# Altium schematic sheet UC3842原理图.SchDoc (part 1 of 2)
size 1651 x 1651 mm; SheetNumber: 12; SheetTotal: 16
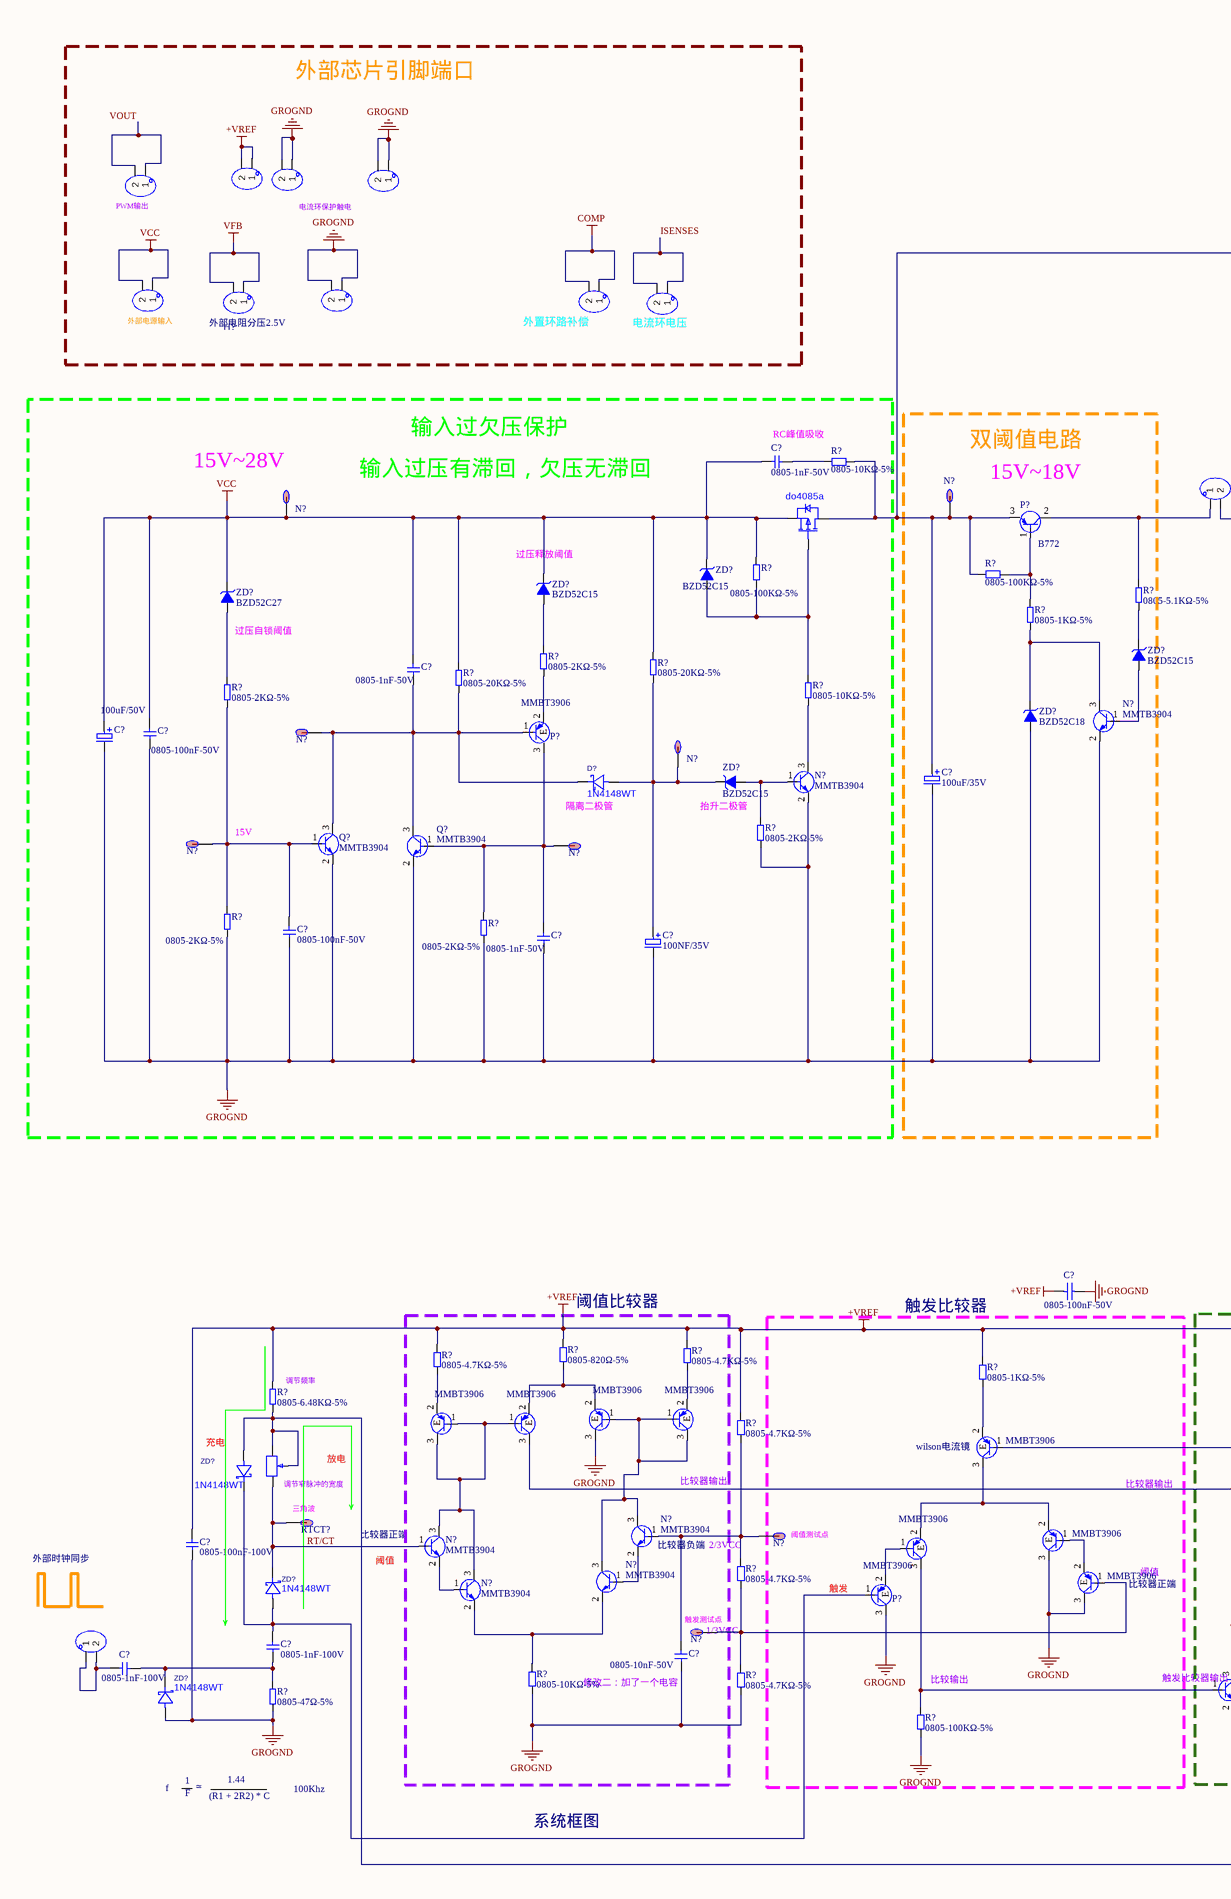
[diagram p0: UC3842原理图.SchDoc, top column 1 of 4]
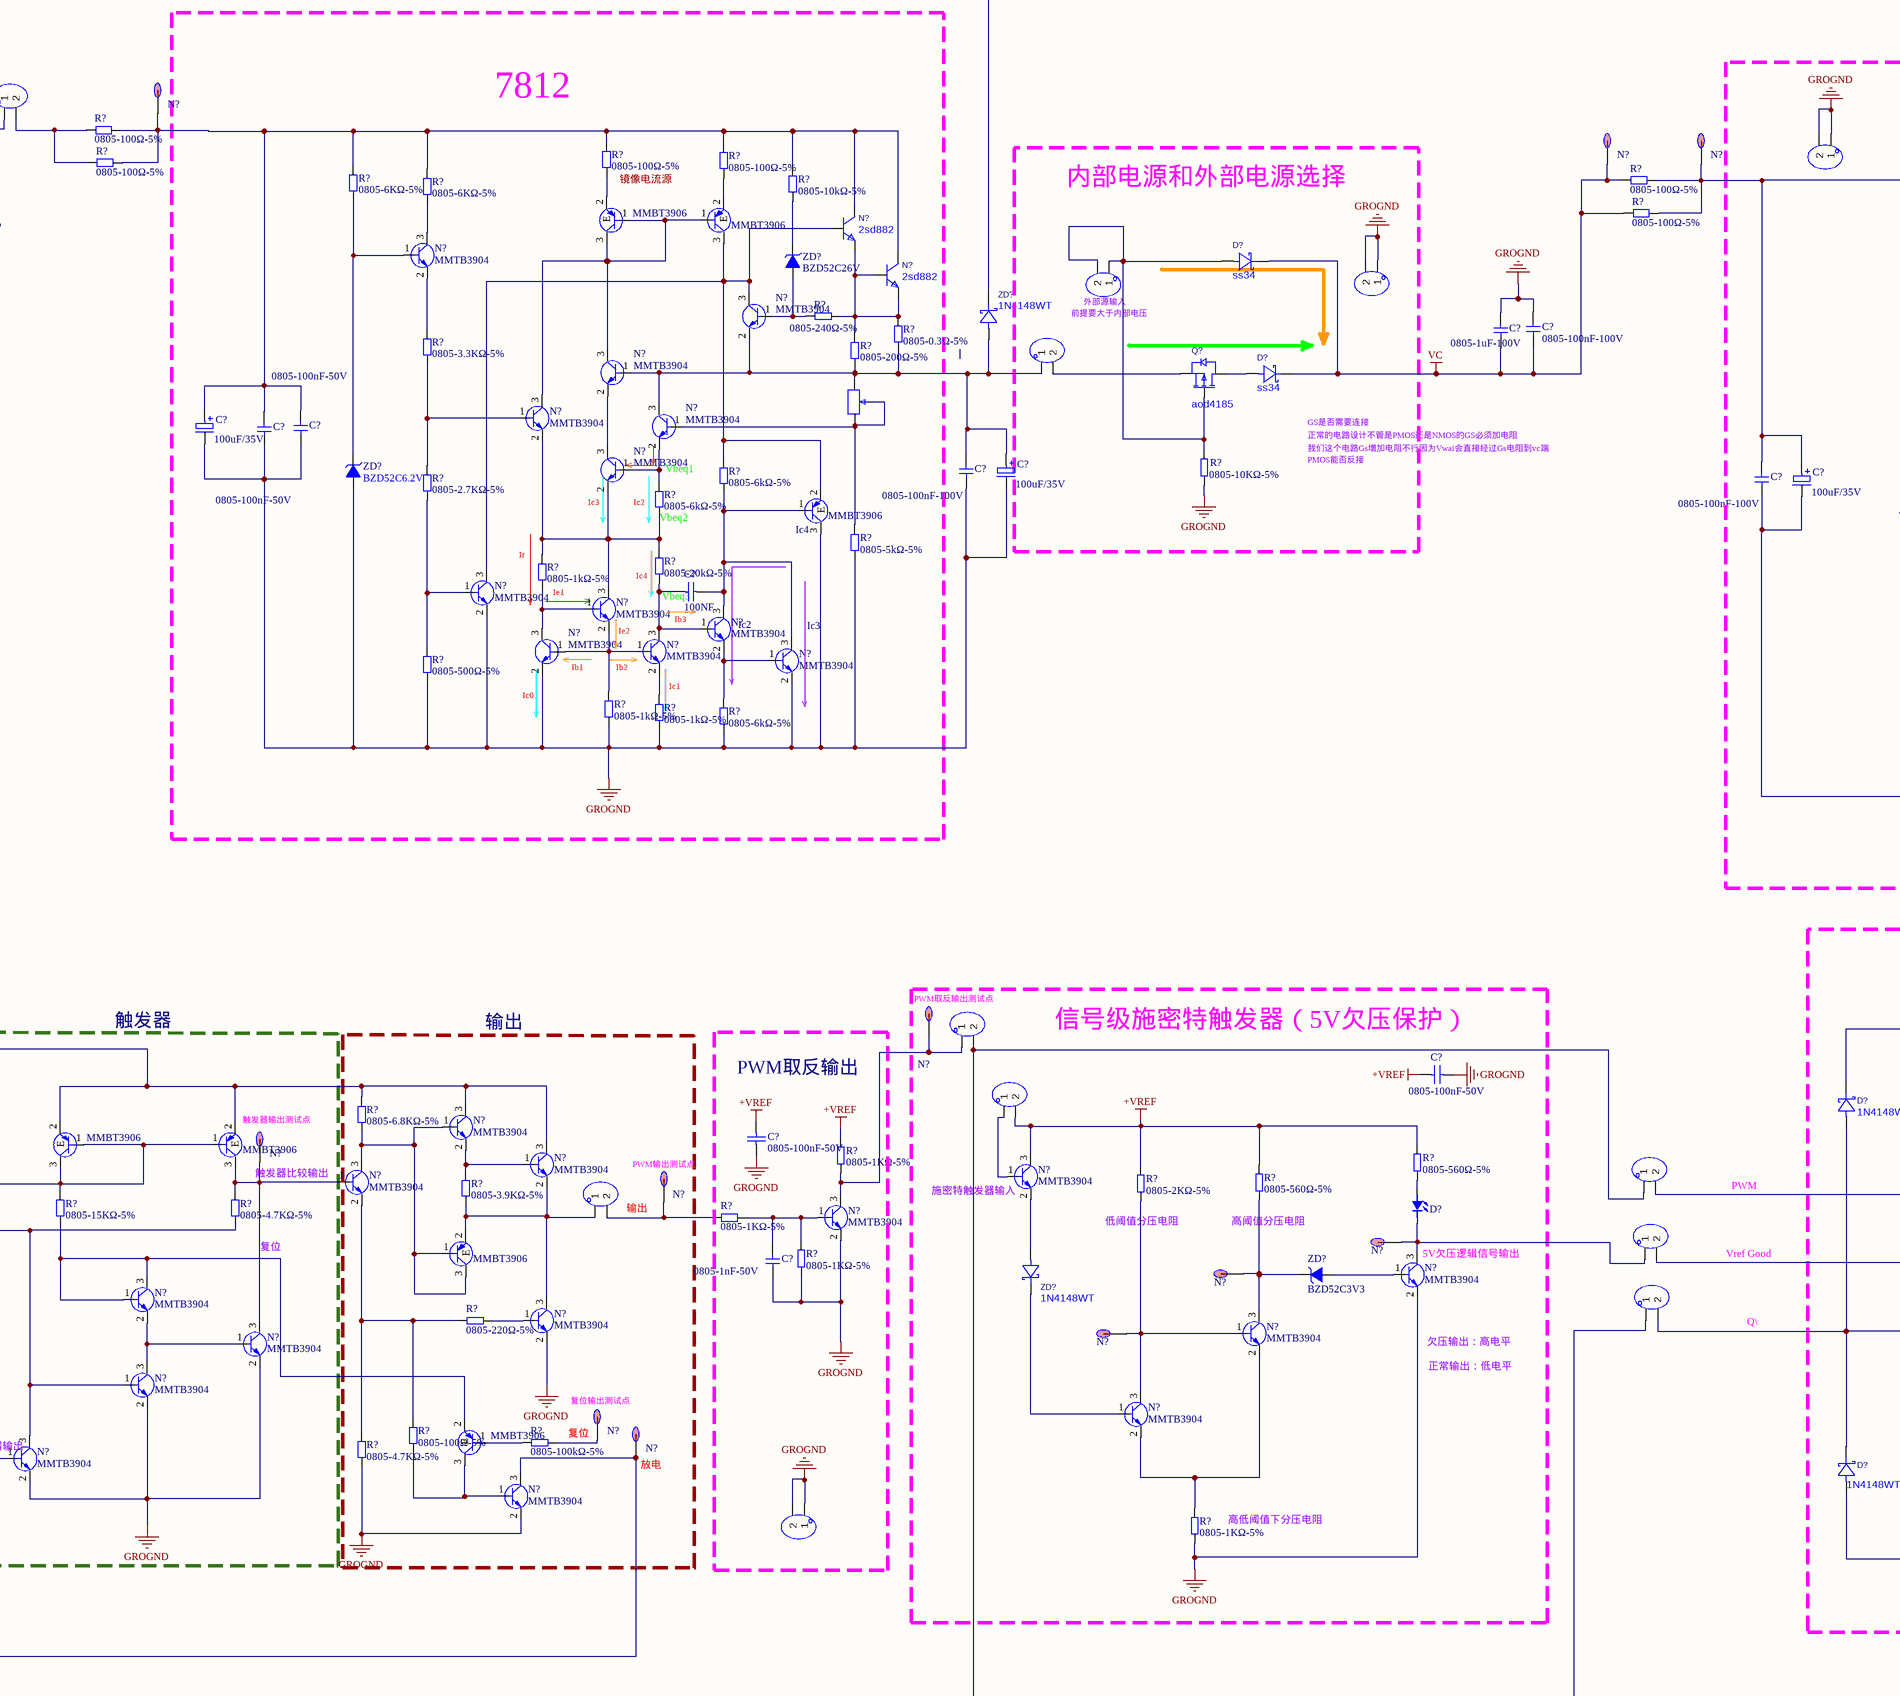
[diagram p1: UC3842原理图.SchDoc, top column 2 of 4]
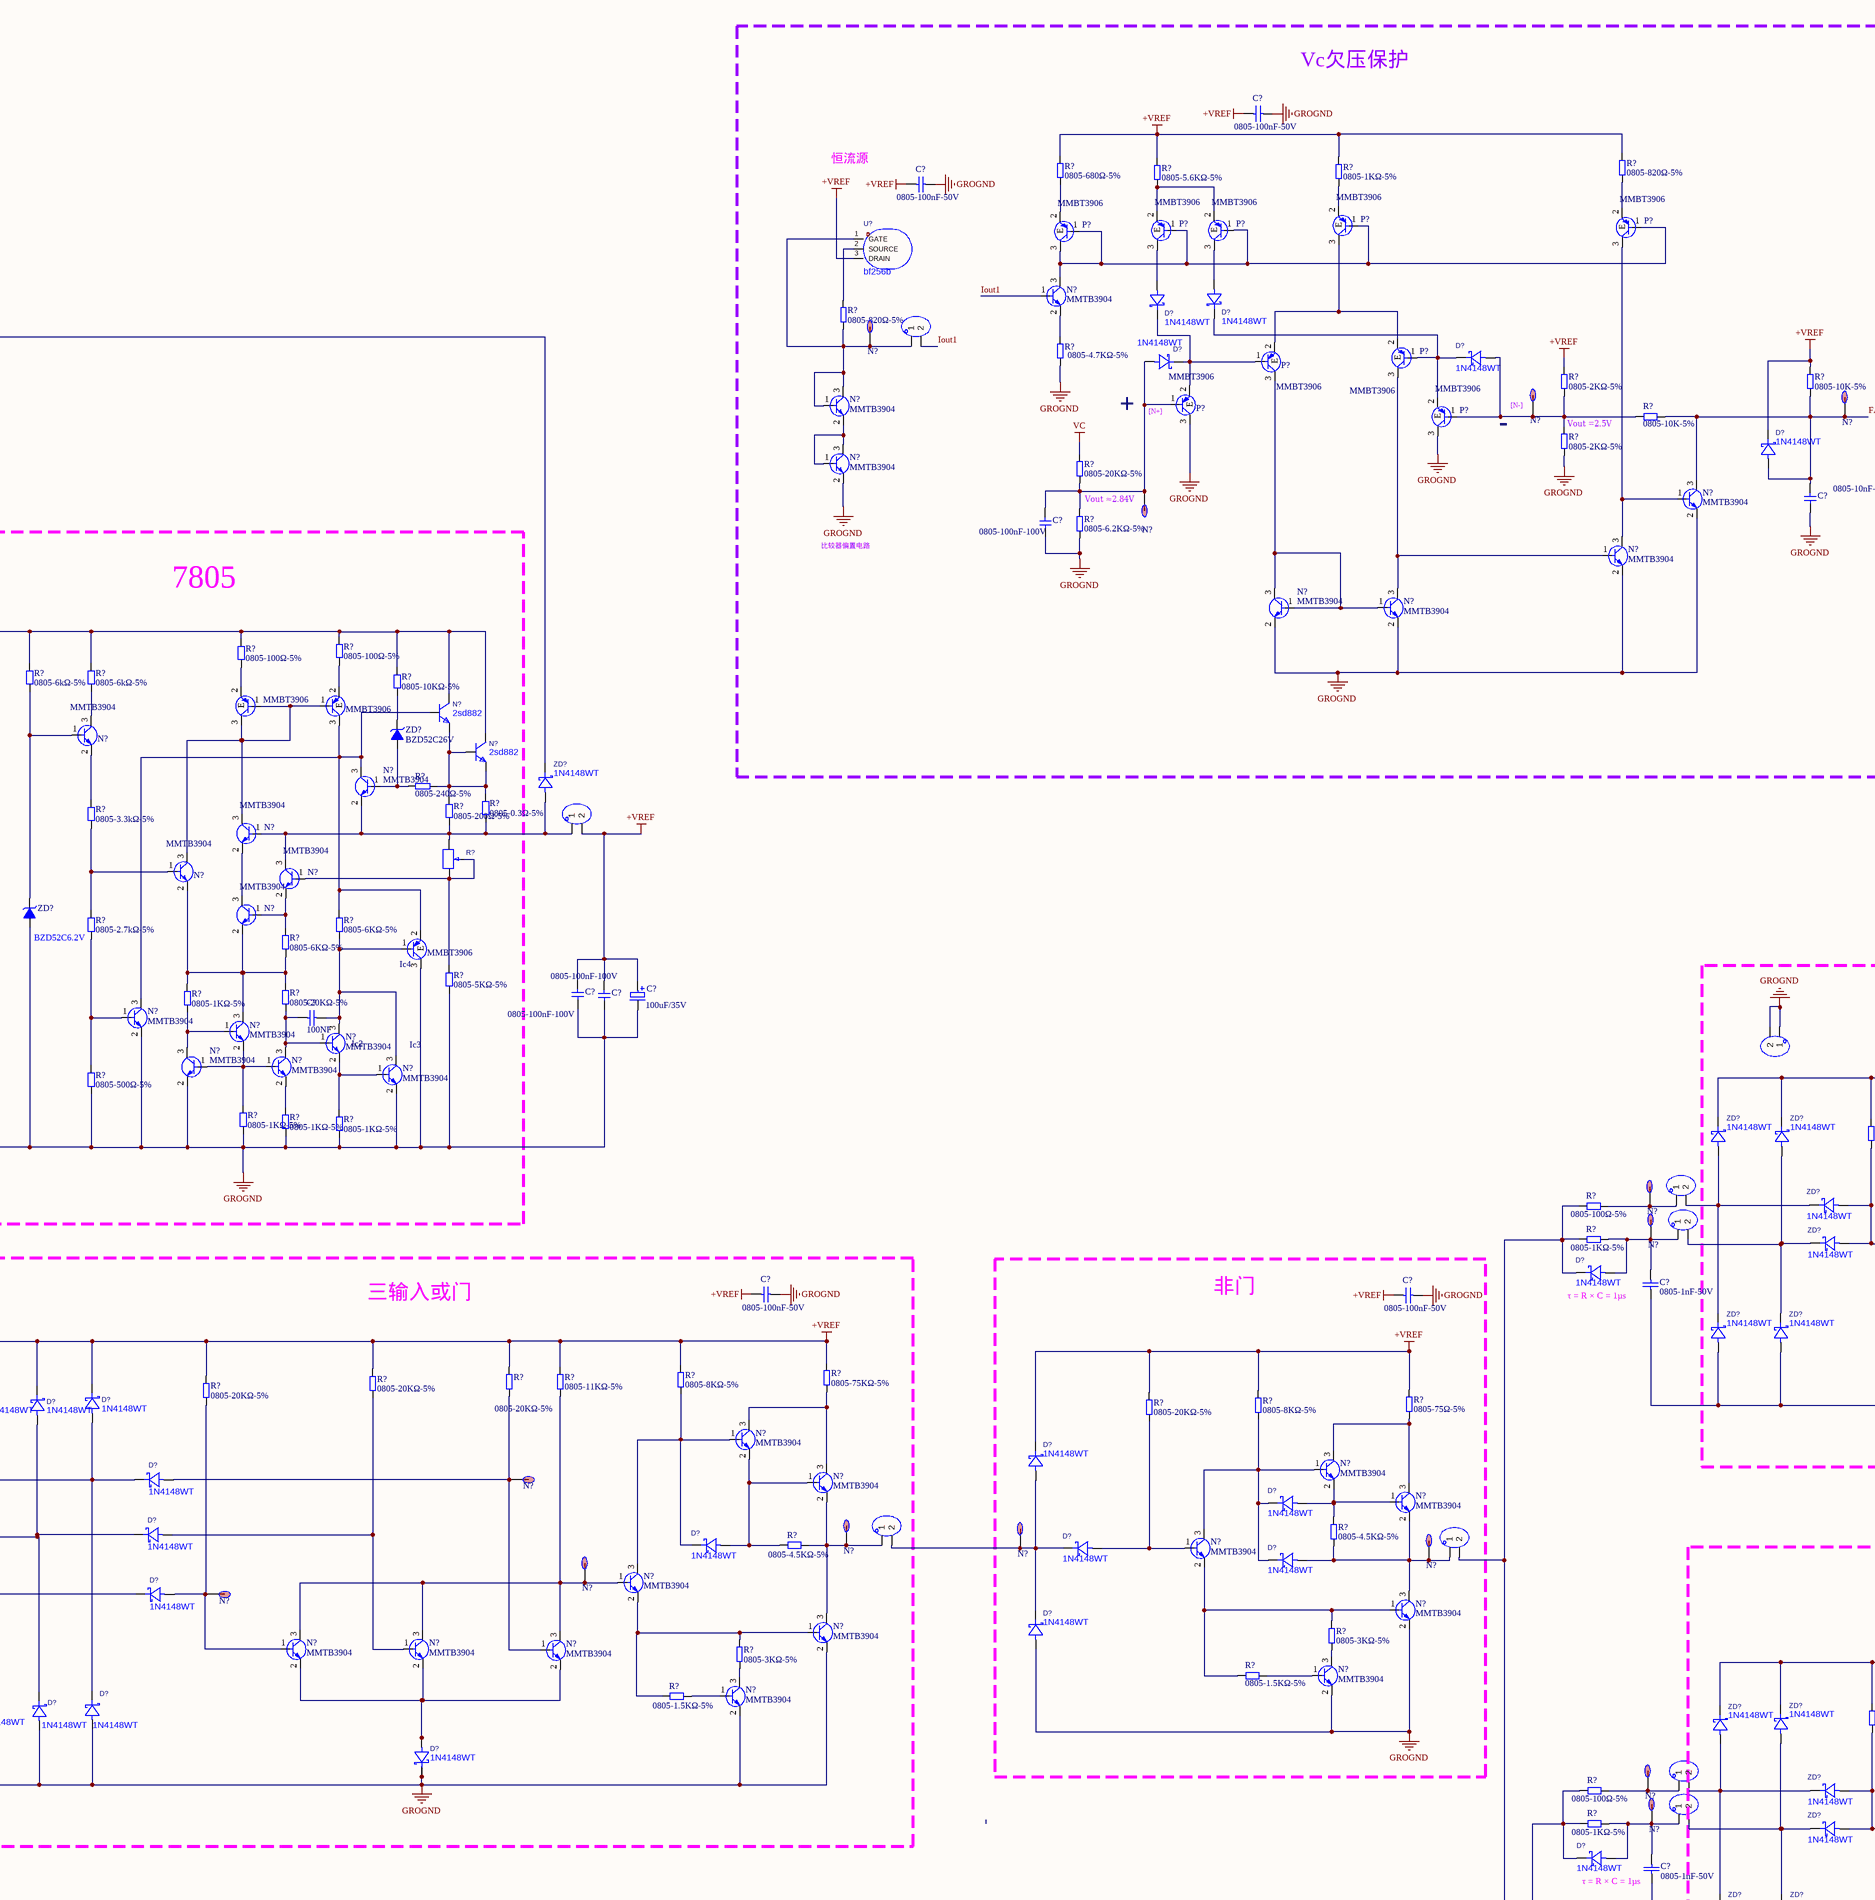
[diagram p2: UC3842原理图.SchDoc, top column 3 of 4]
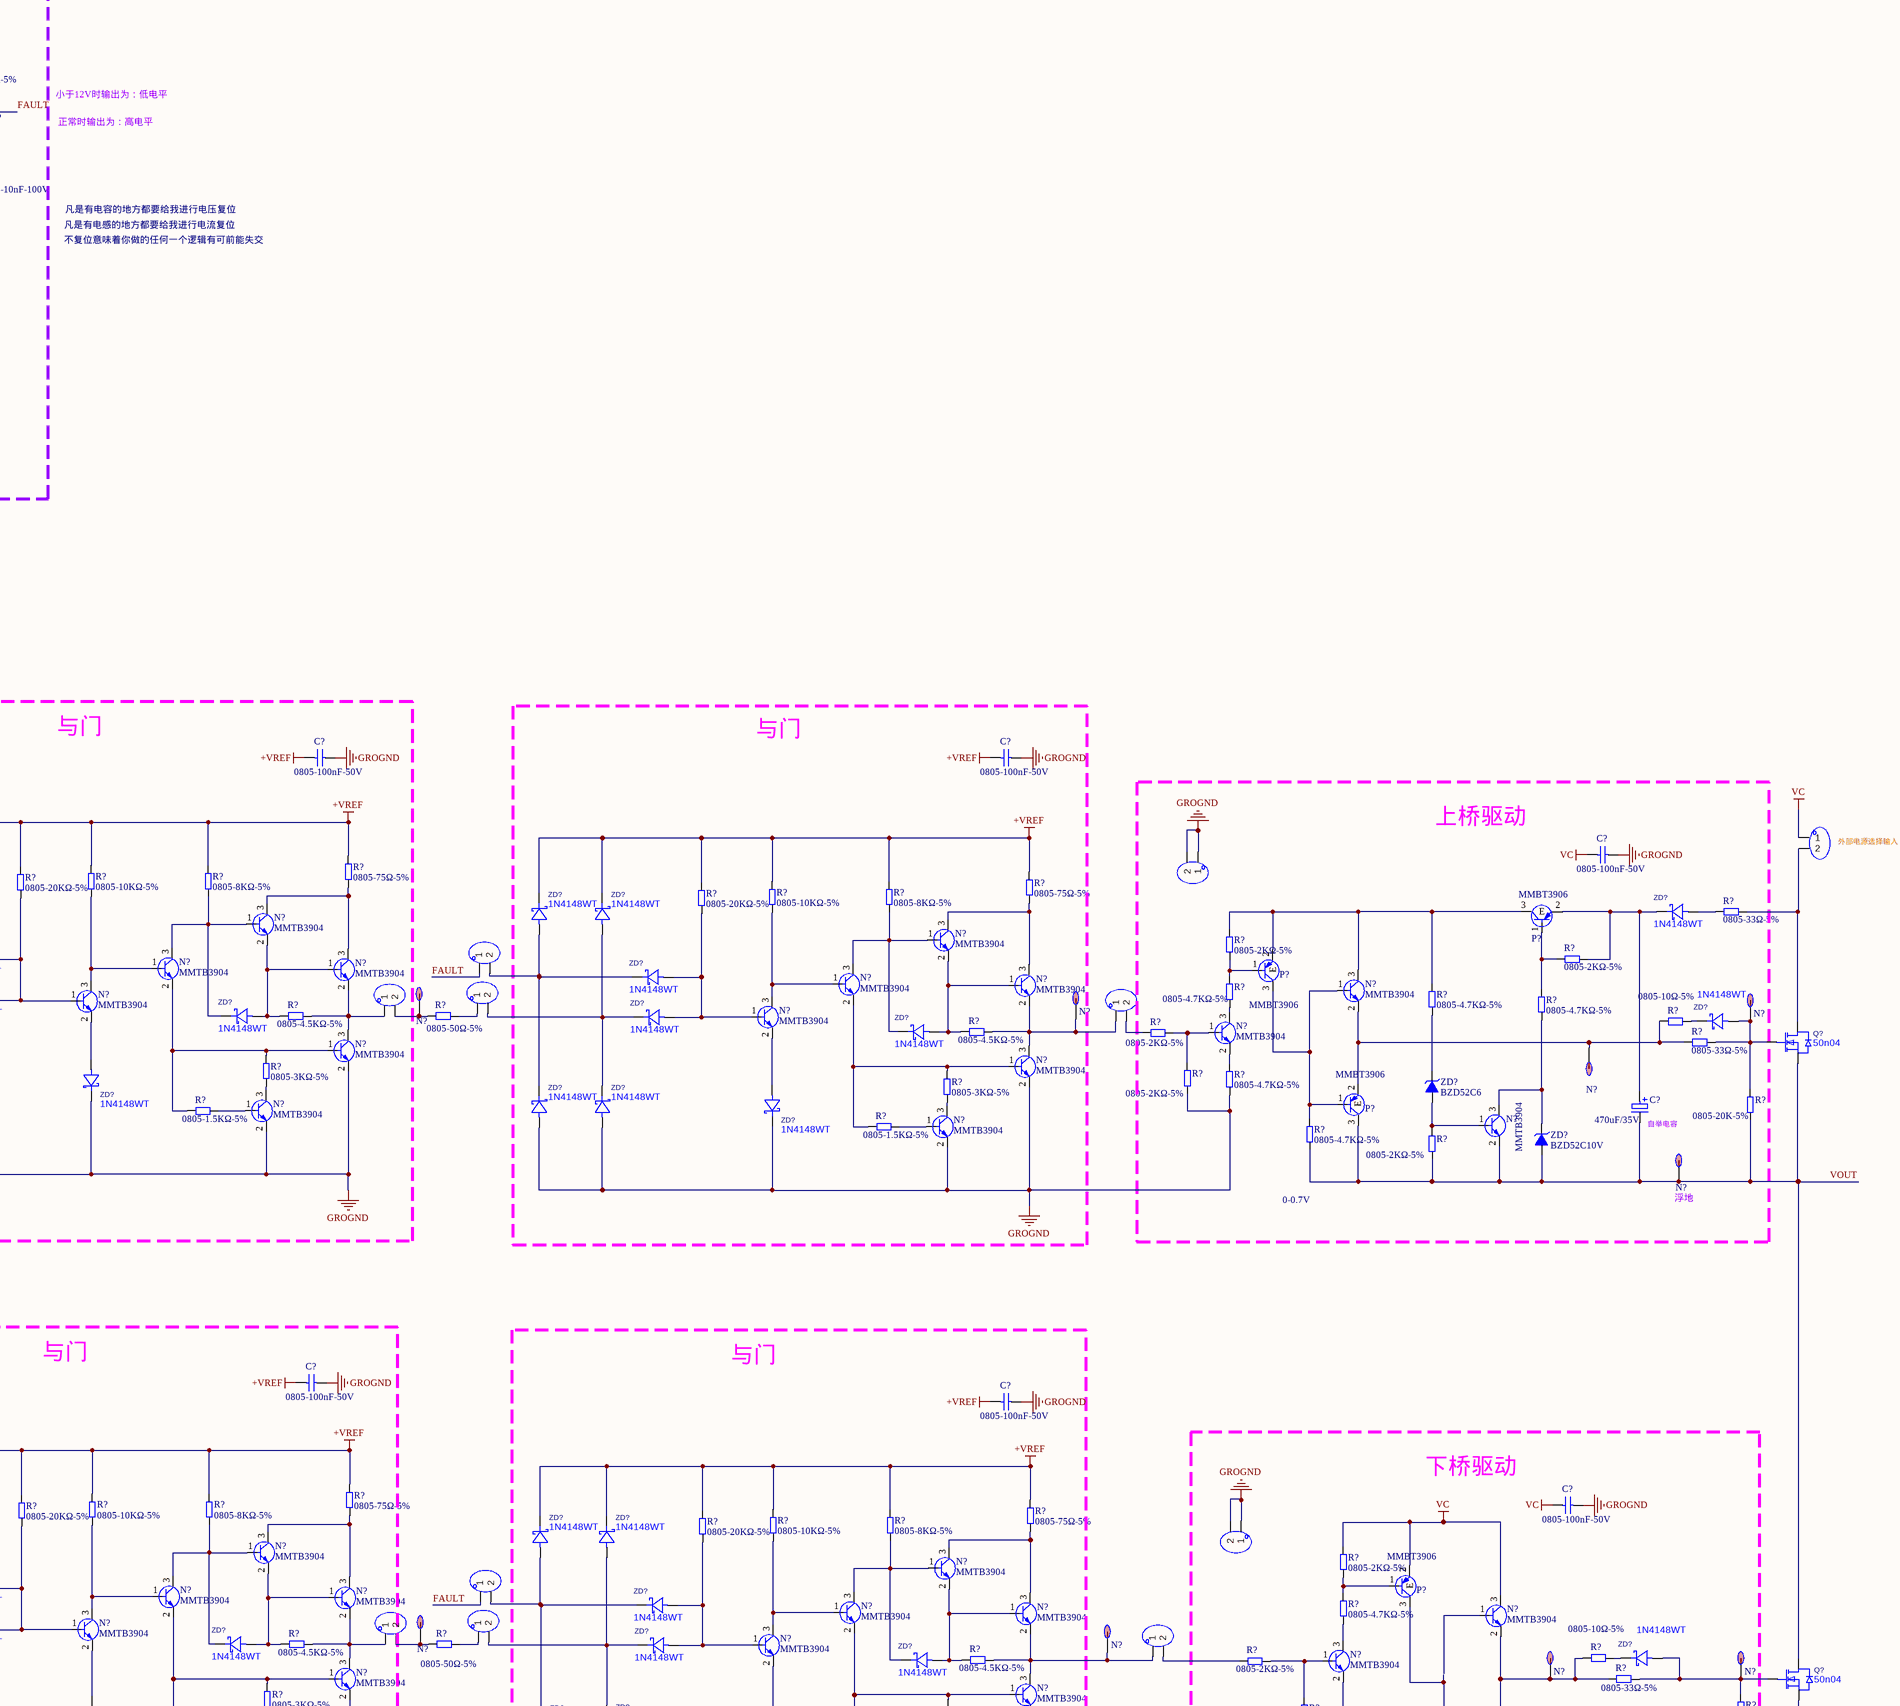
[diagram p3: UC3842原理图.SchDoc, top column 4 of 4]
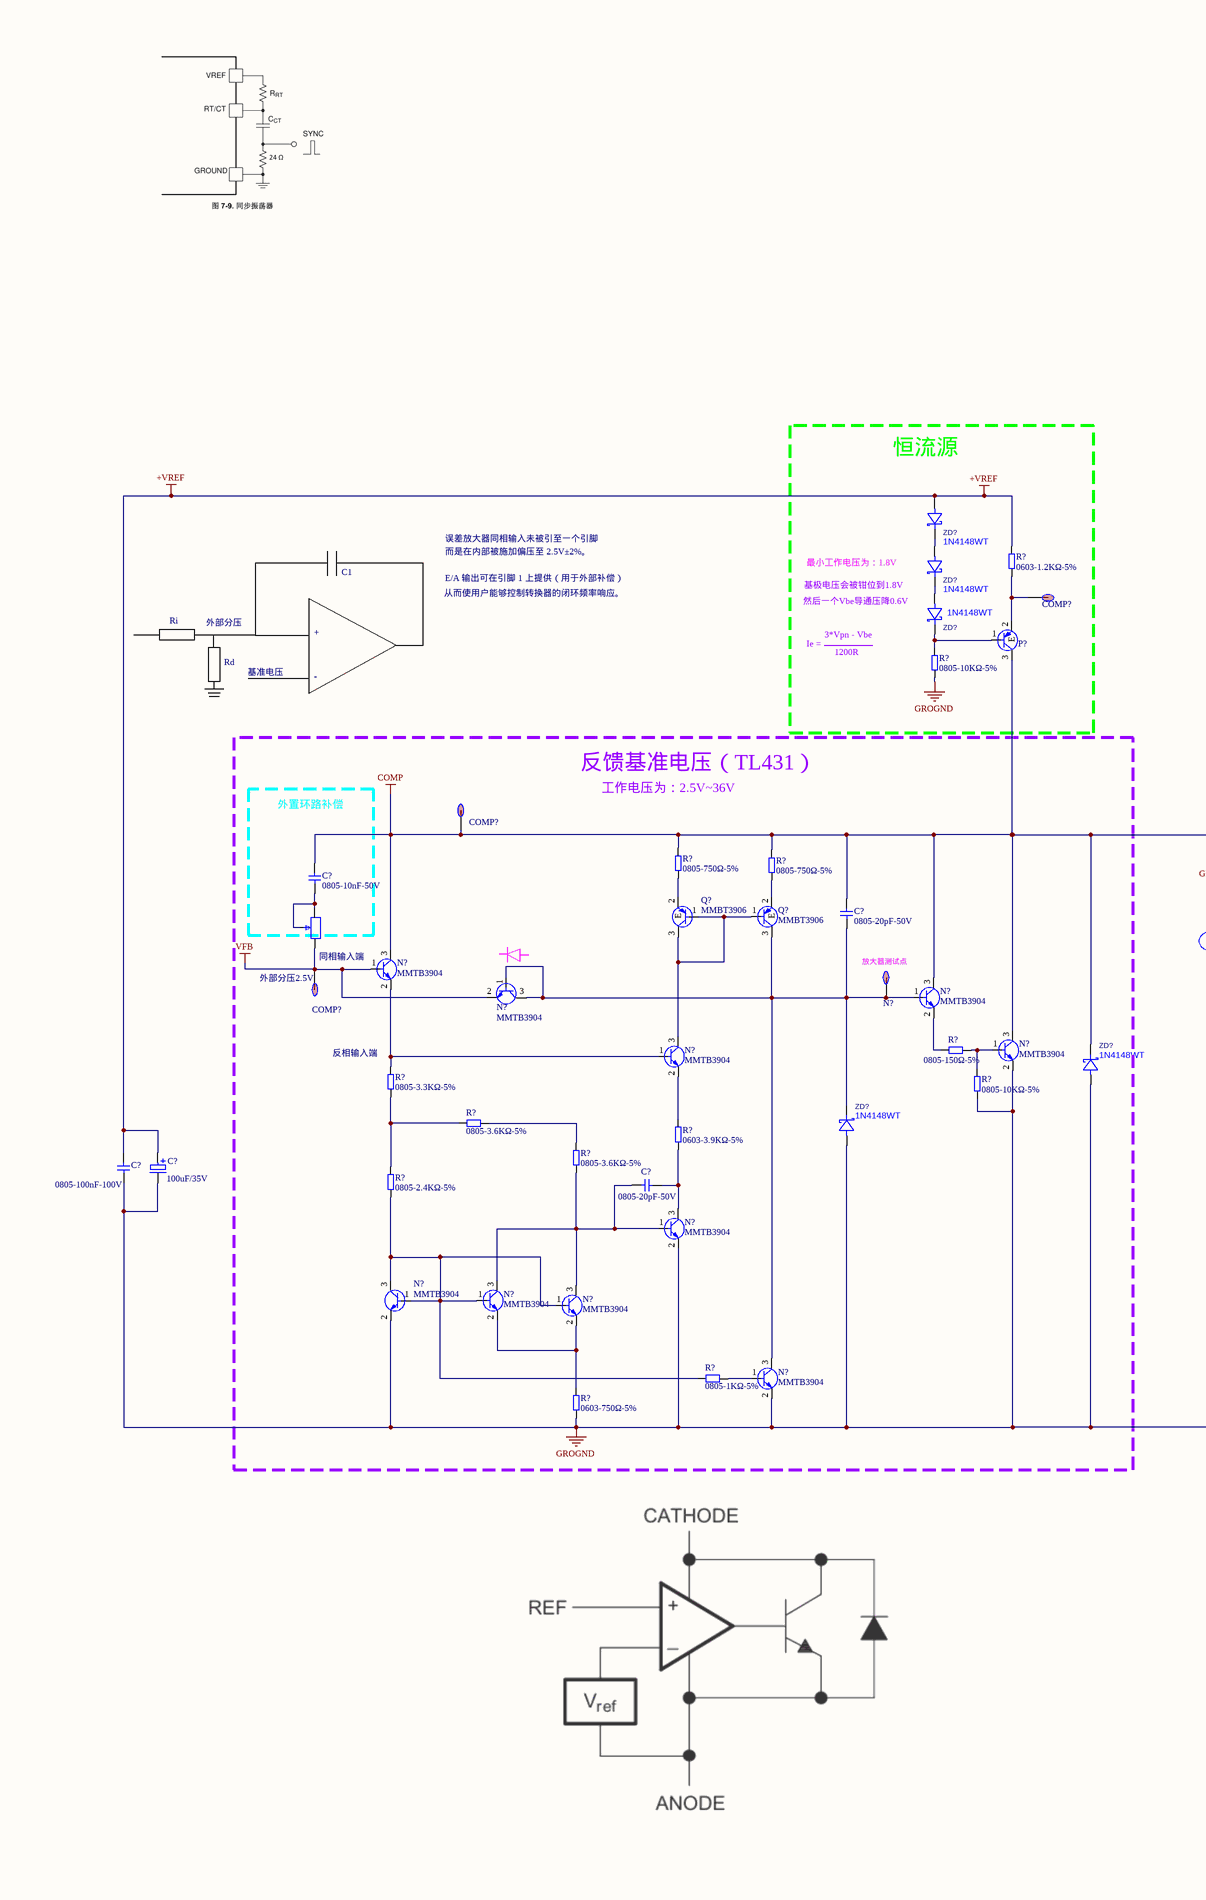
[diagram p4: UC3842原理图.SchDoc, centre column 1 of 4]
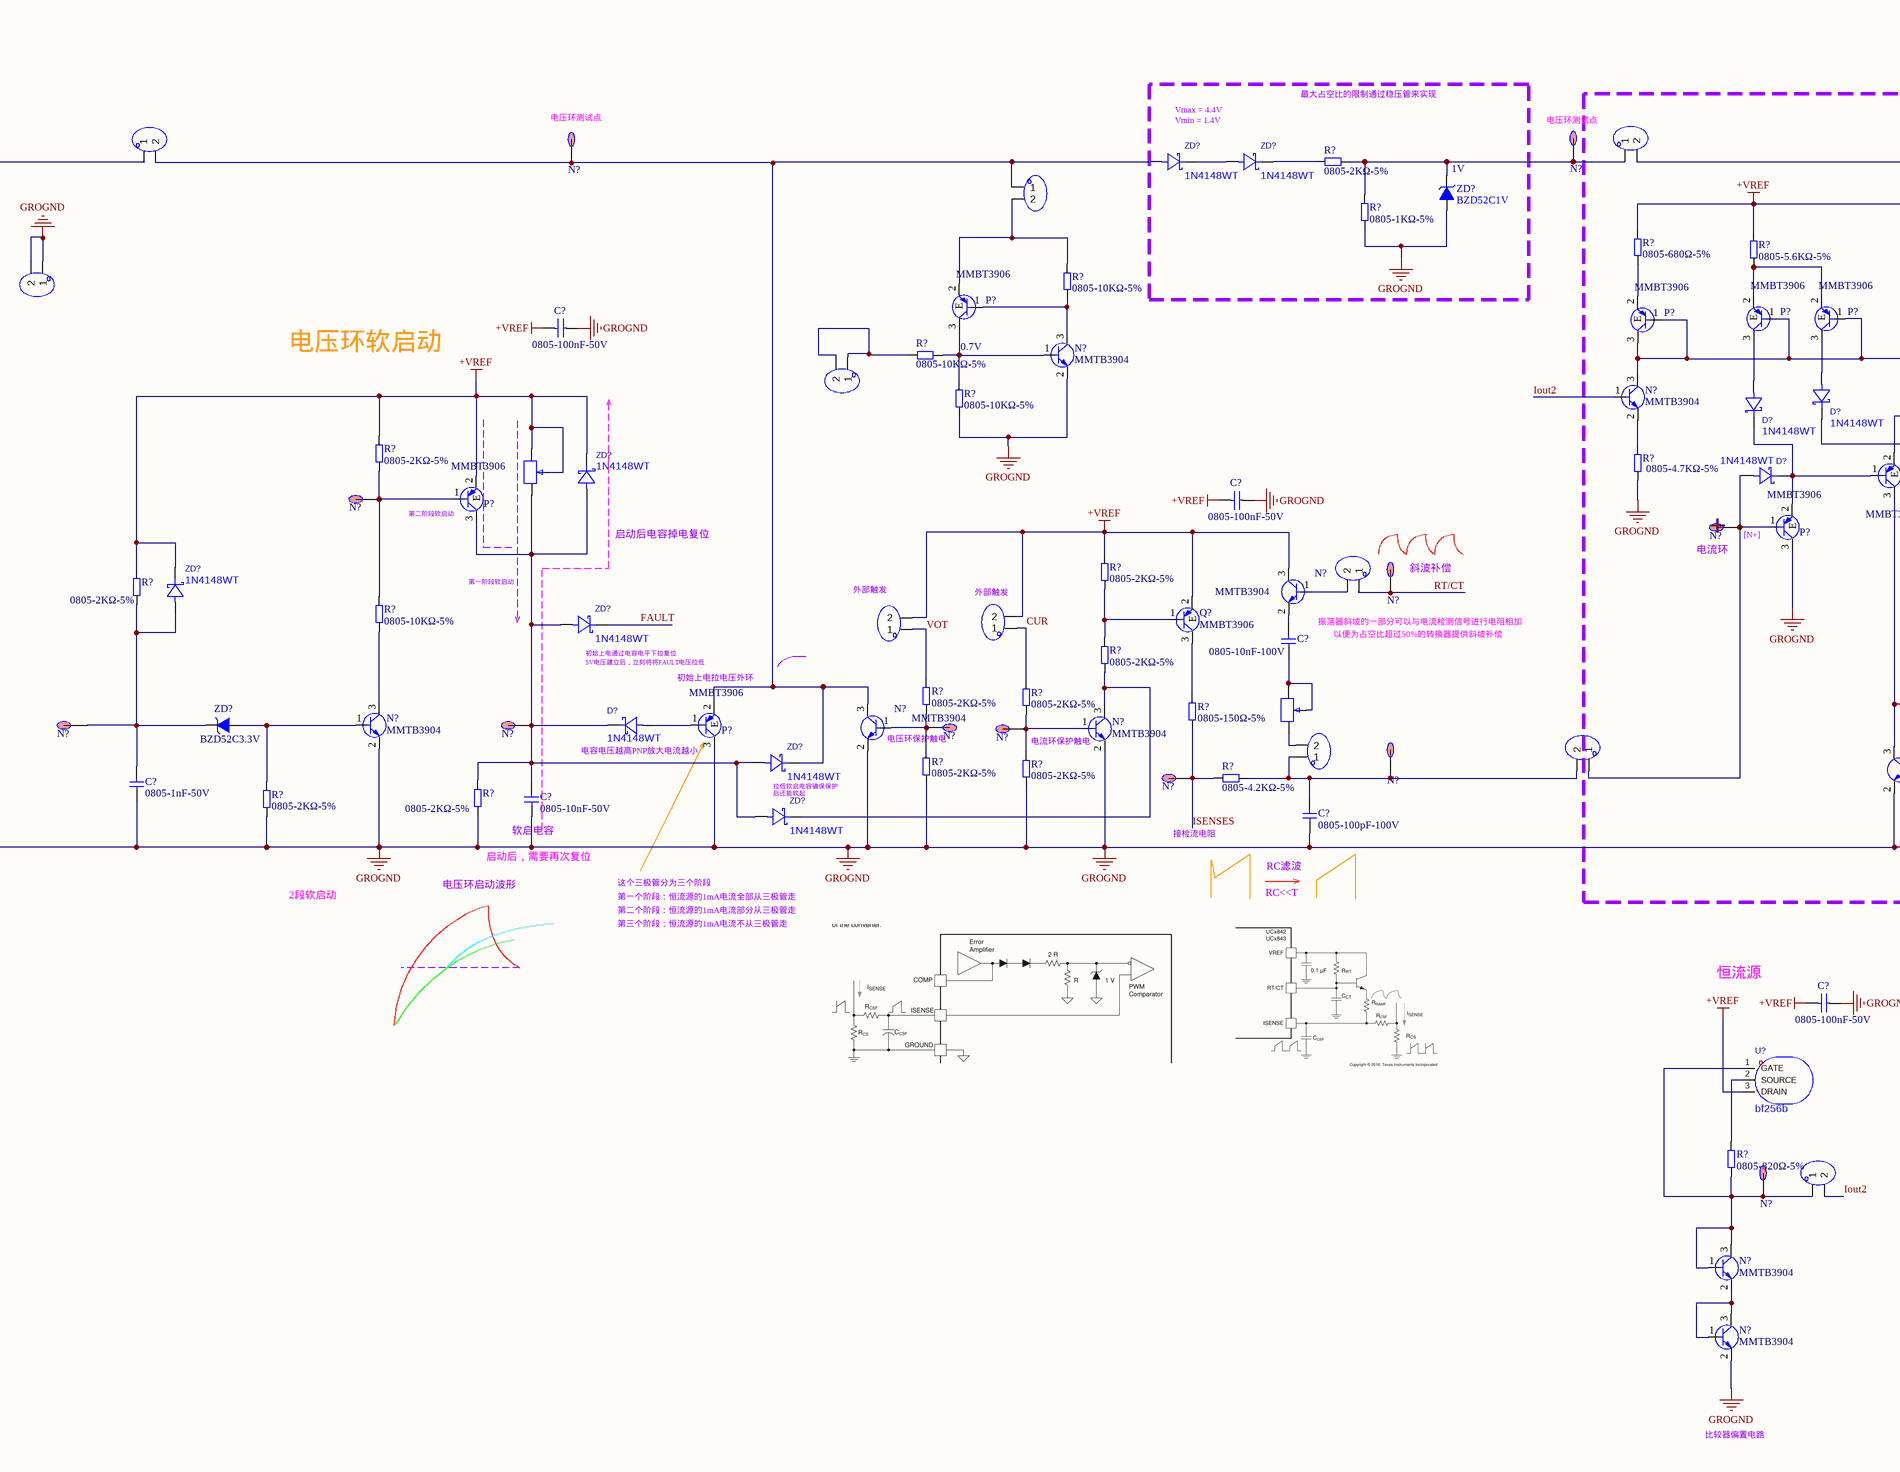
[diagram p5: UC3842原理图.SchDoc, centre column 2 of 4]
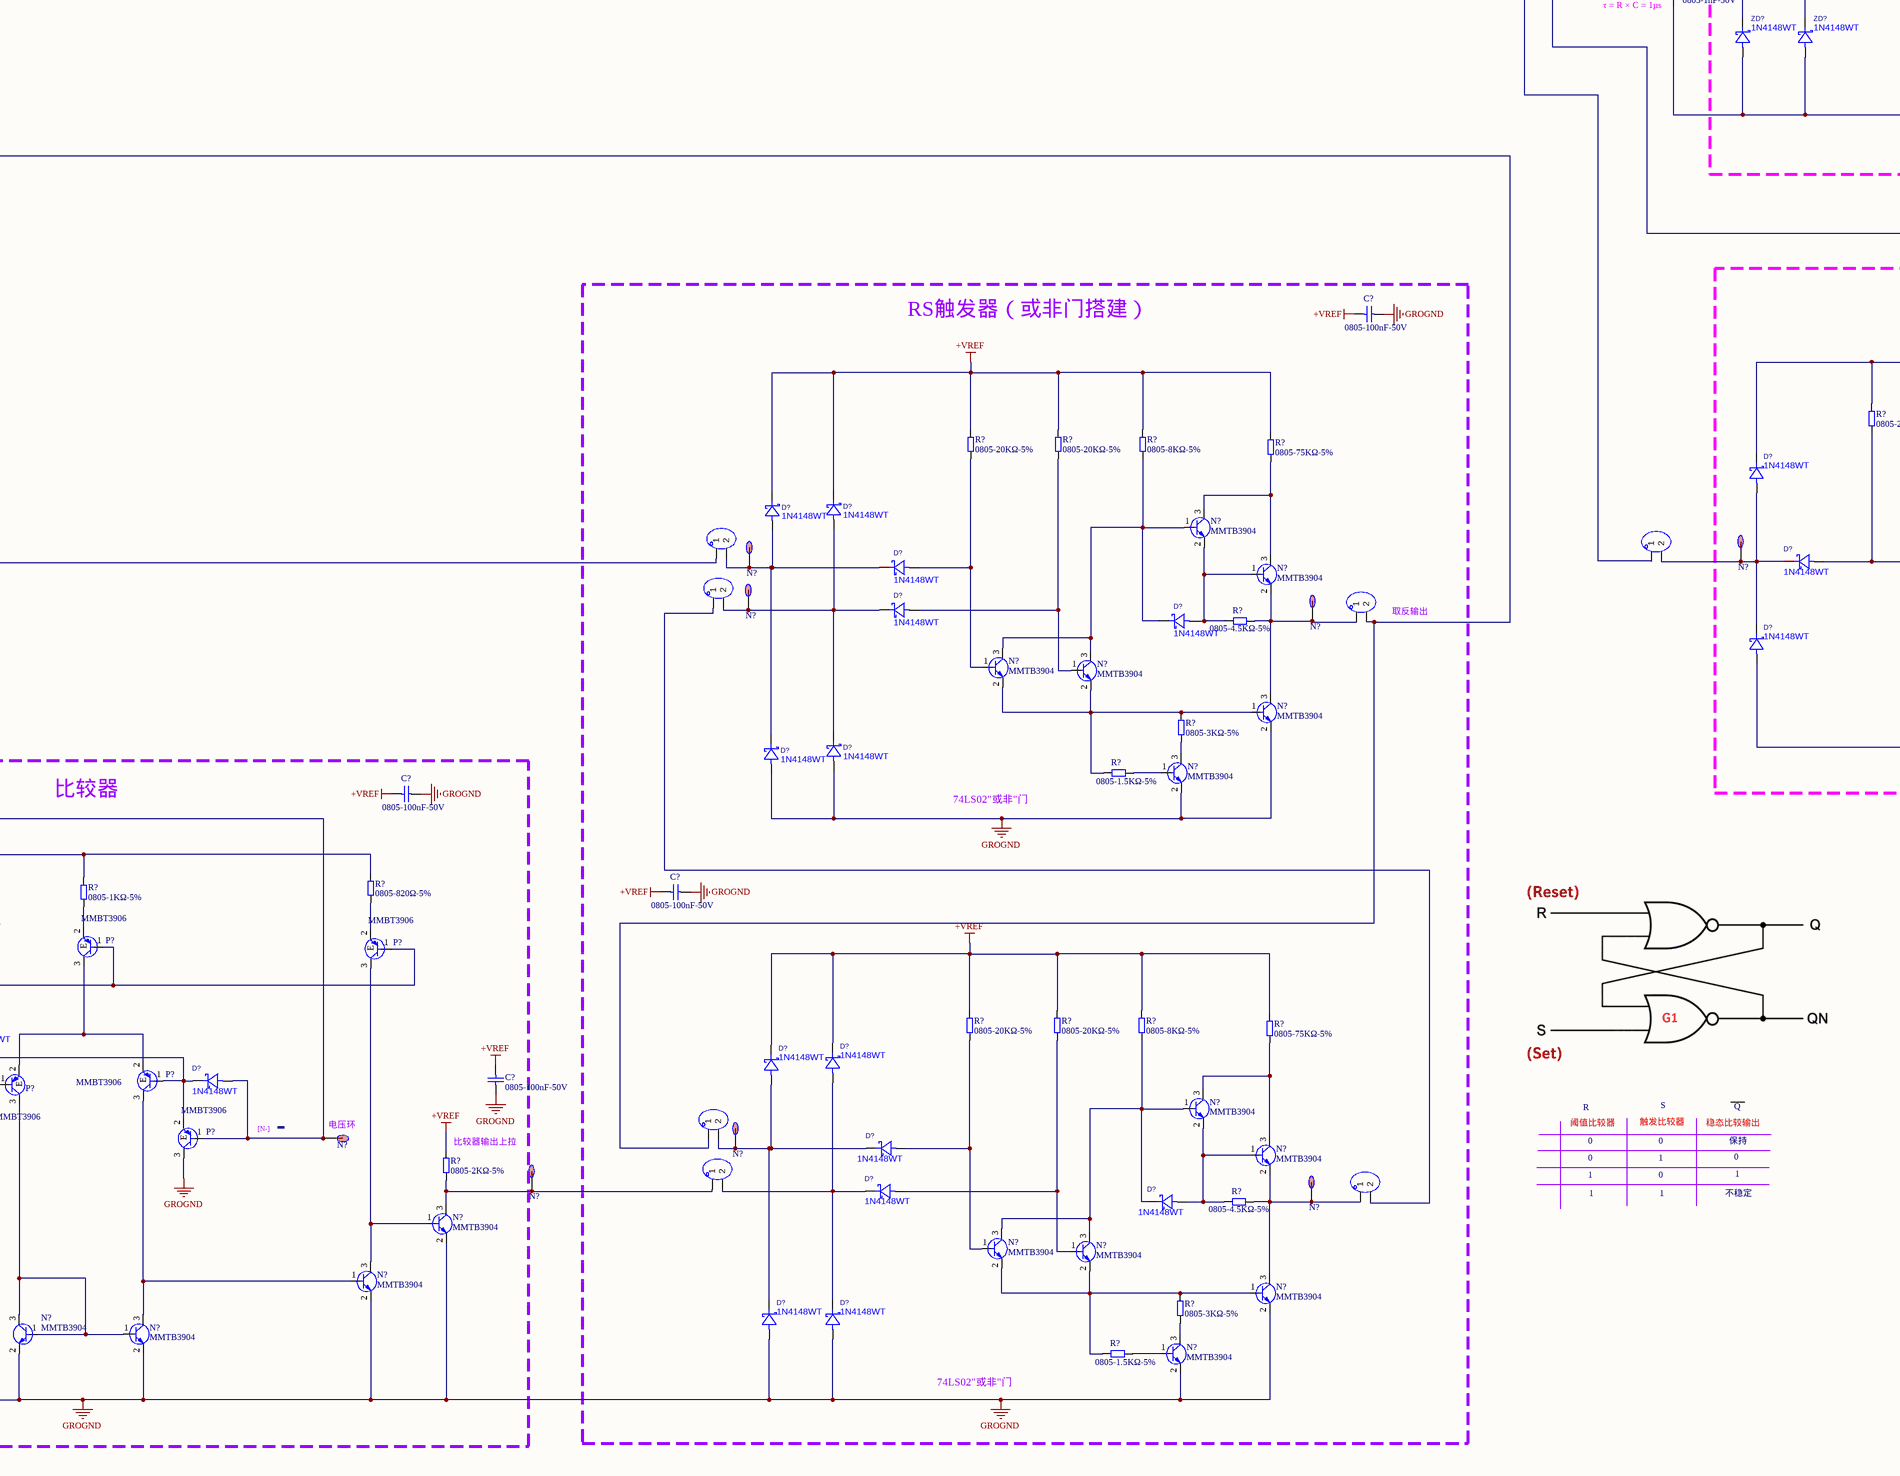
[diagram p6: UC3842原理图.SchDoc, centre column 3 of 4]
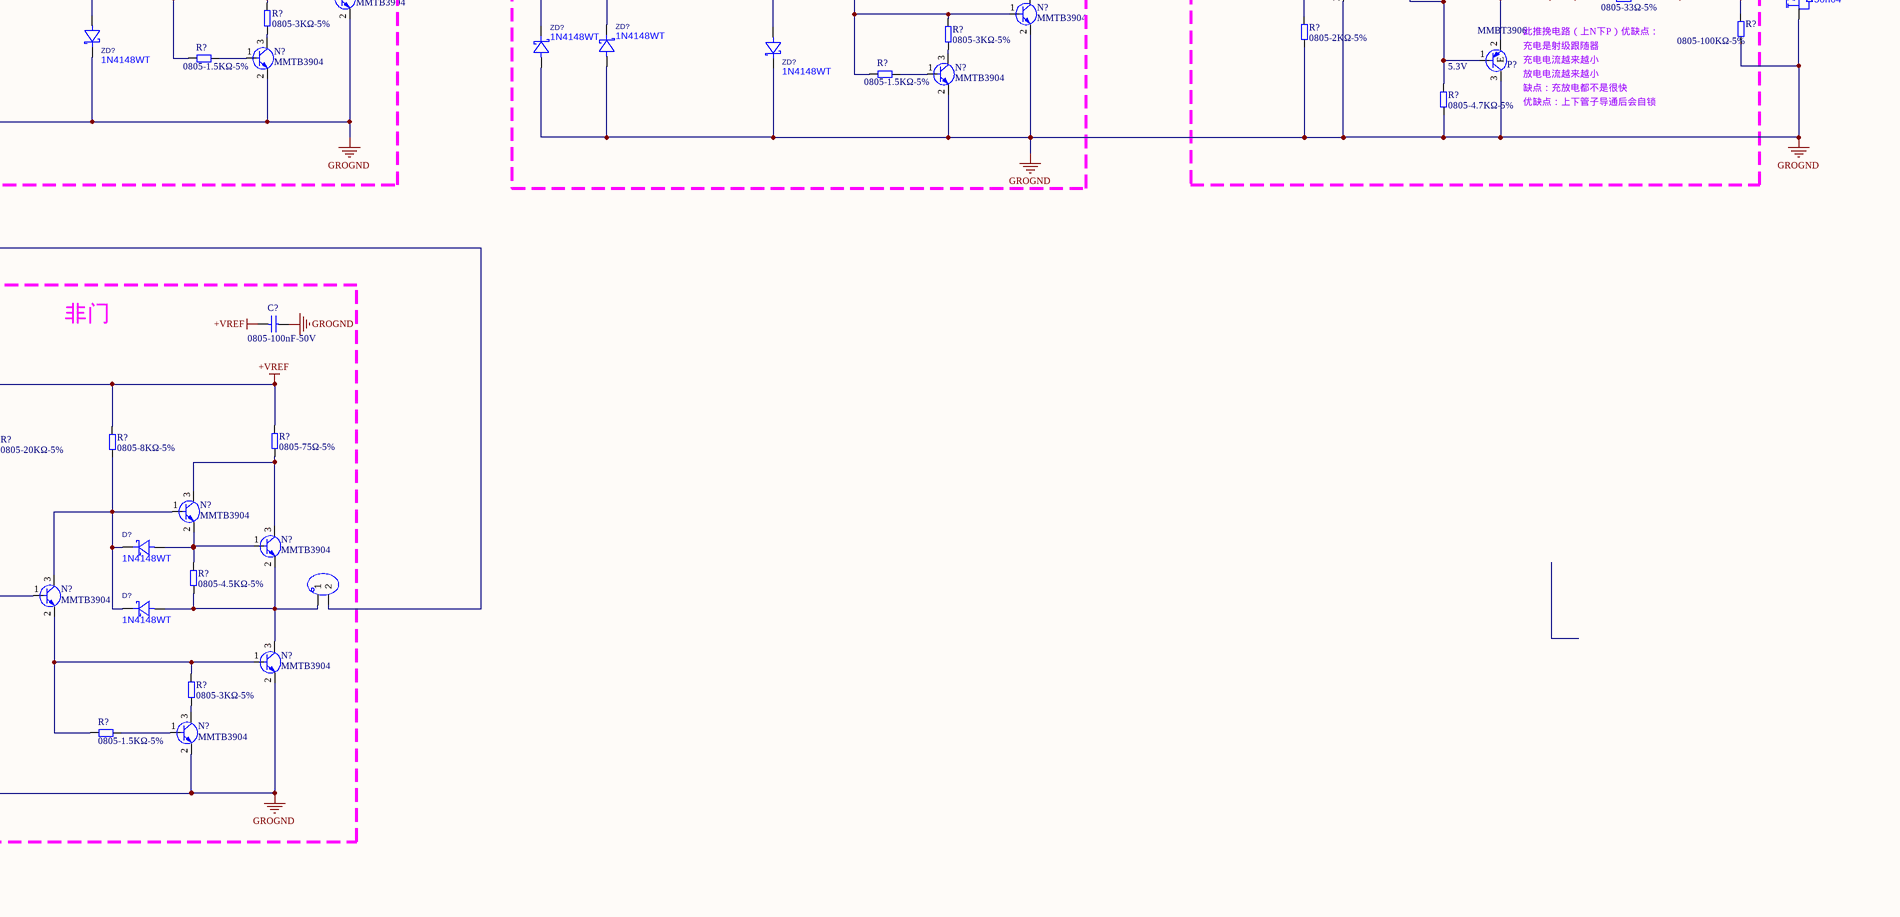
[diagram p7: UC3842原理图.SchDoc, centre column 4 of 4]
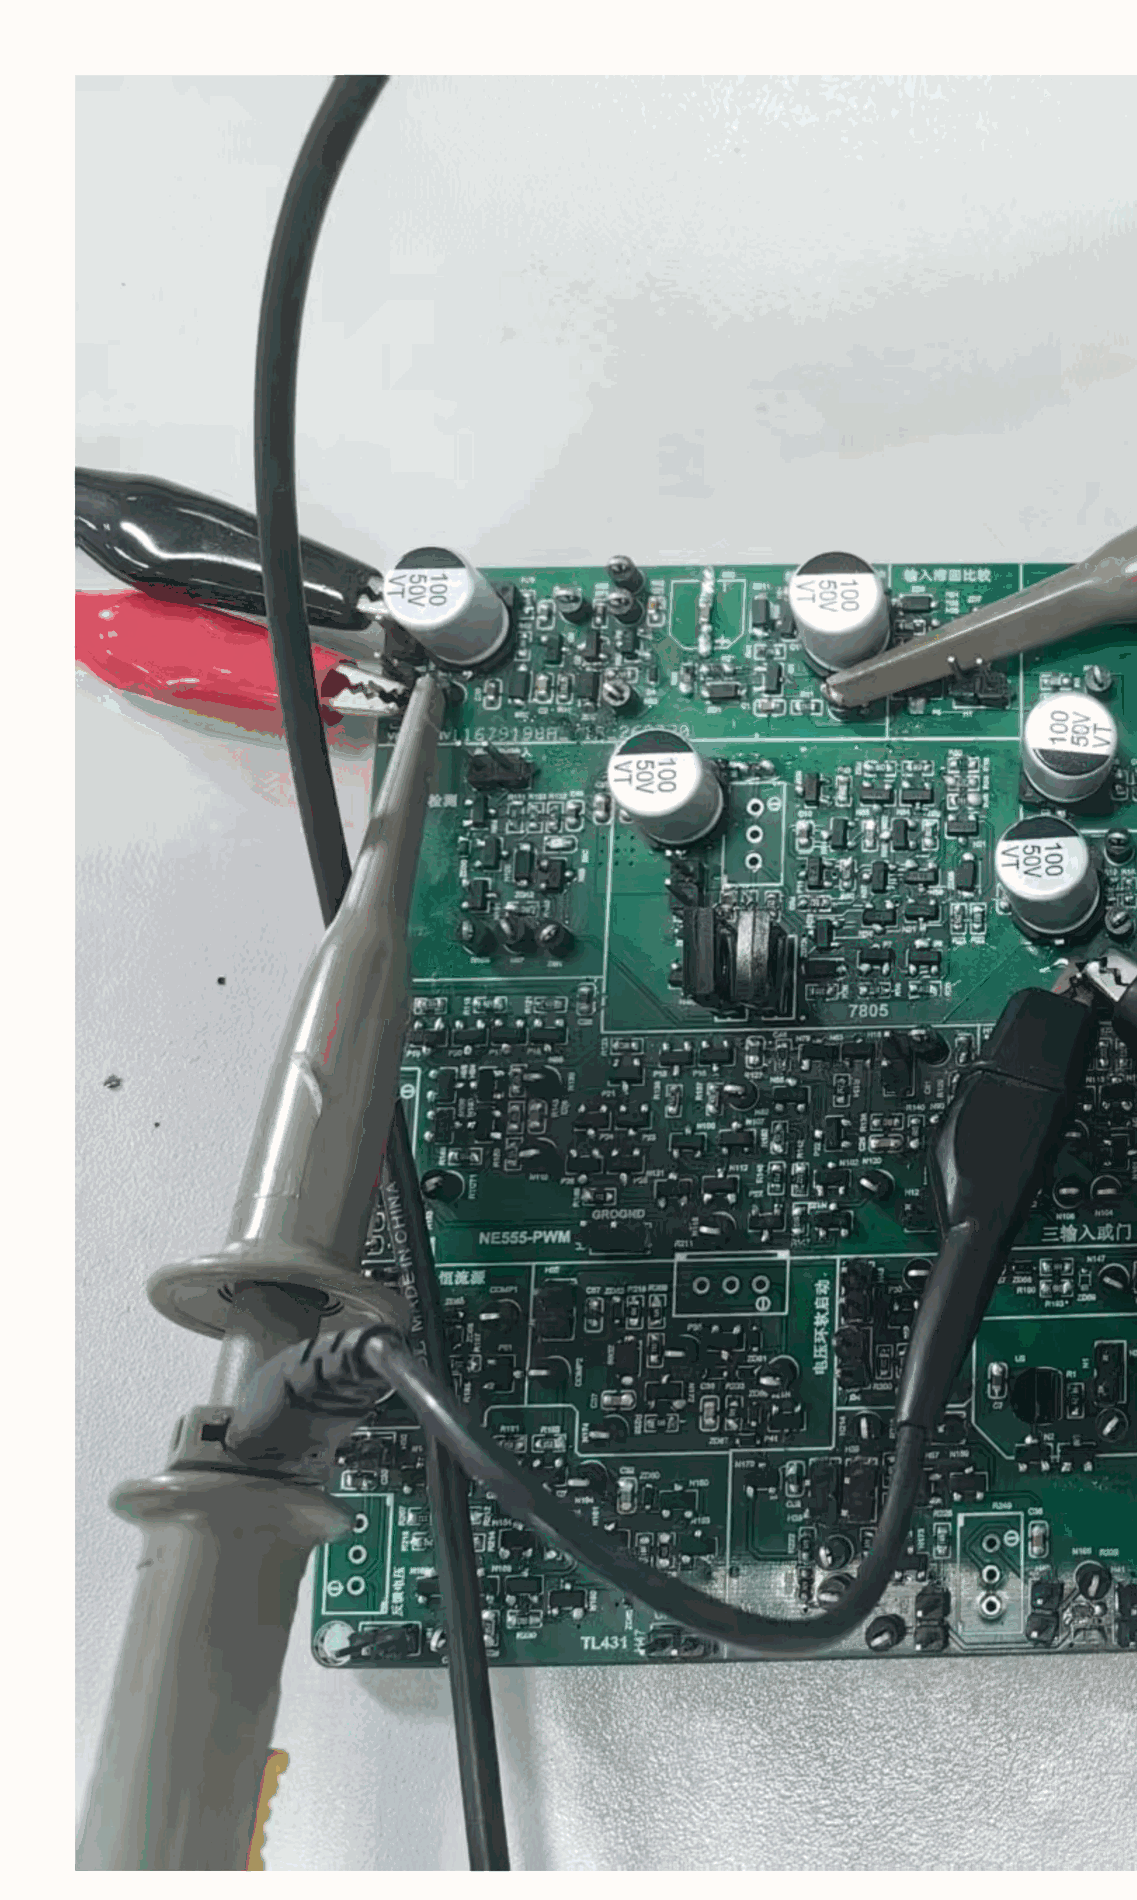
[diagram p8: UC3842原理图.SchDoc, bottom column 2 of 4]
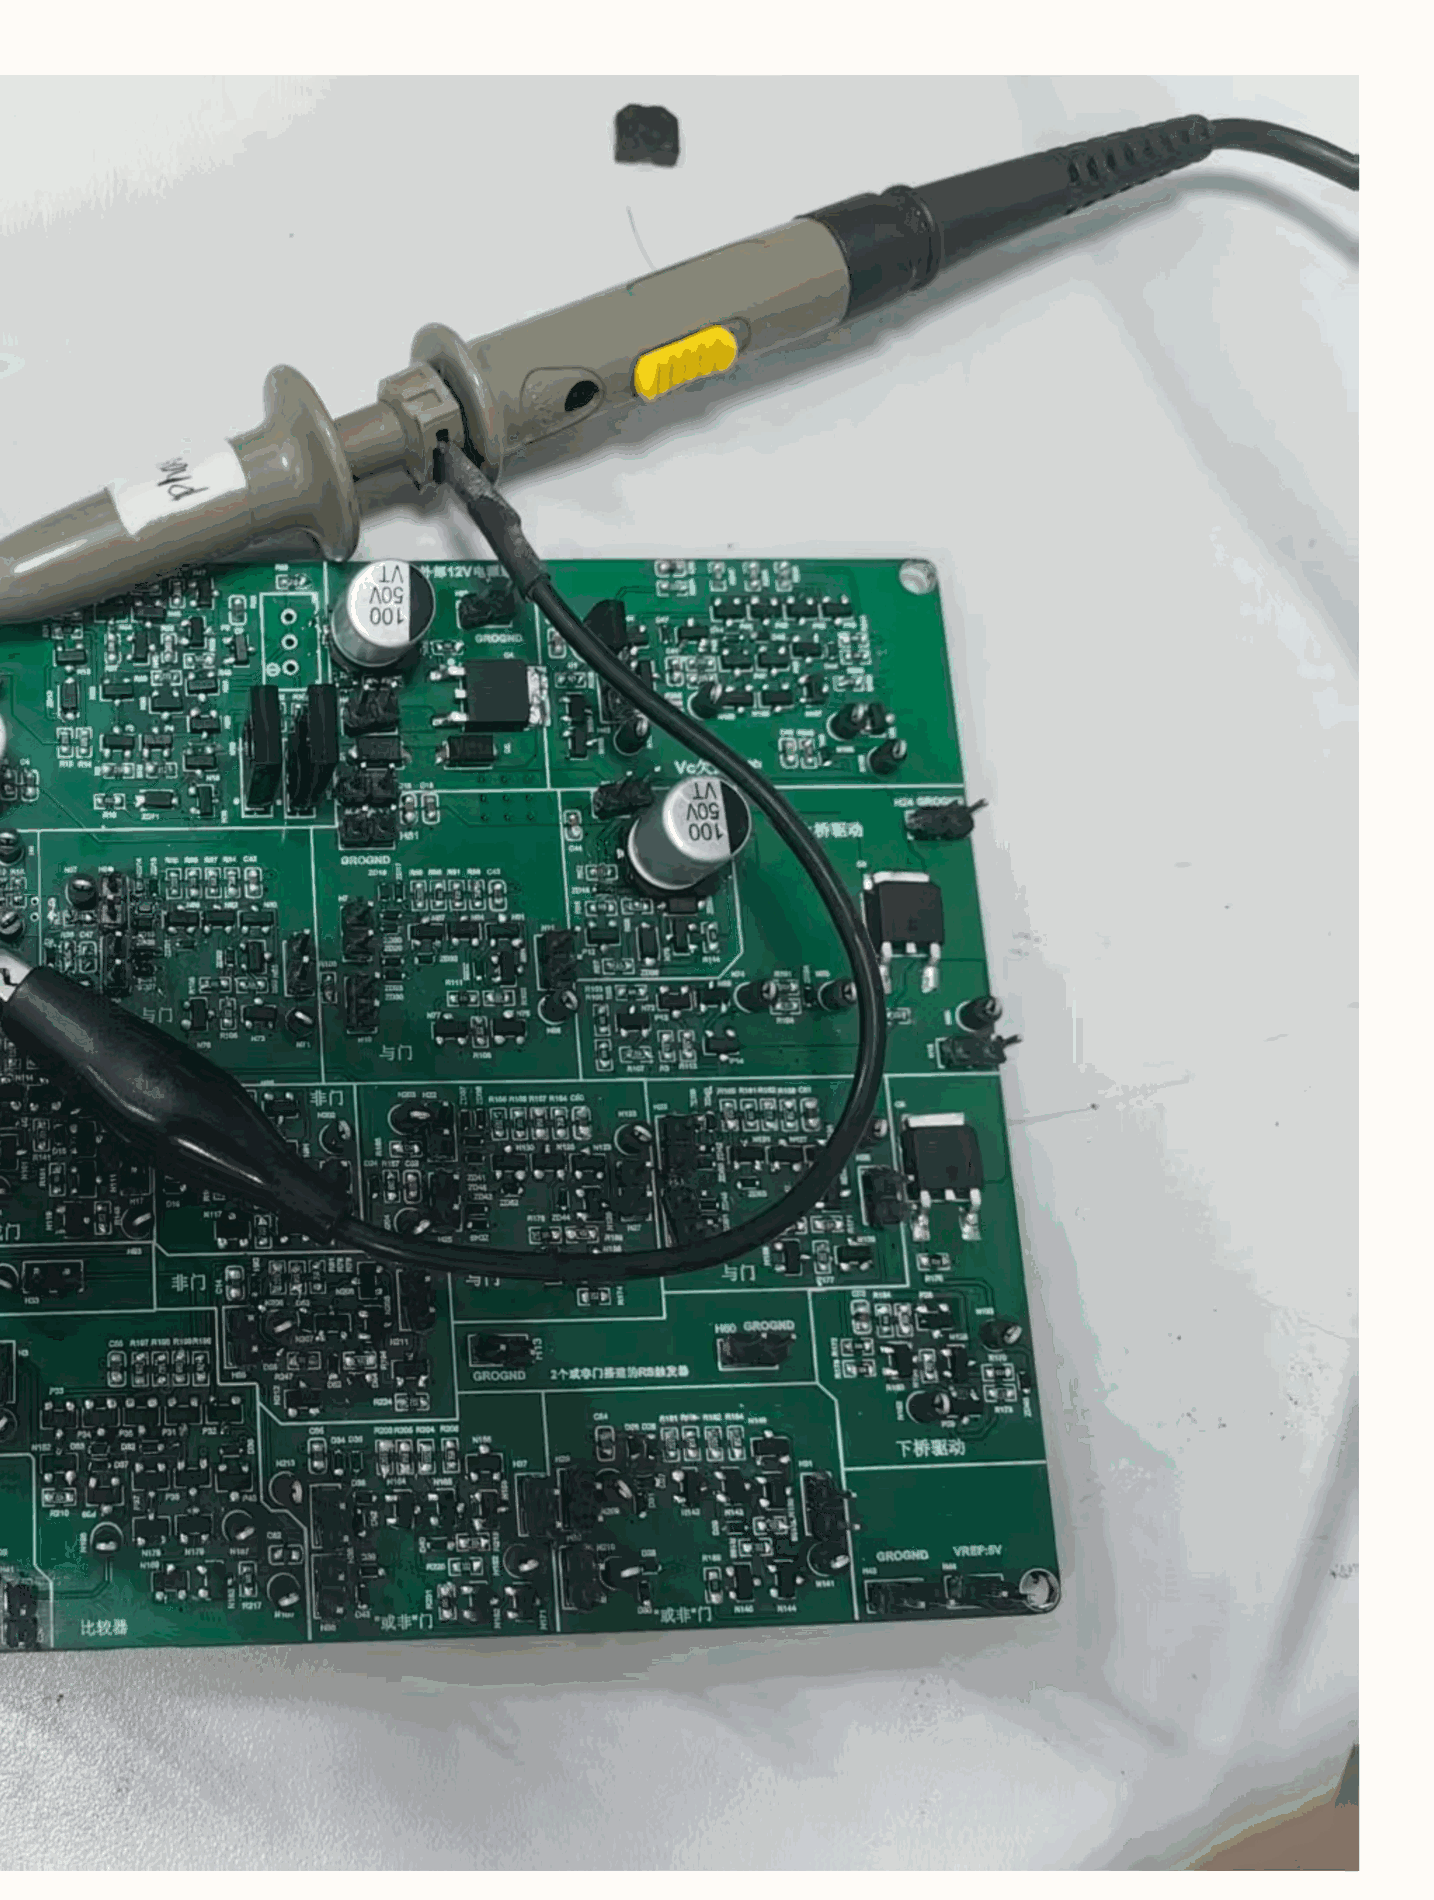
[diagram p9: UC3842原理图.SchDoc, bottom column 3 of 4]

## Parts
(Parts that share a designator on the sheet are numbered #1, #2 ... from top to bottom, then left to right.)
C?#1  0805-100nF-50V  [C0603]
C?#2  0805-100nF-50V  [C0603]
C?#3  0805-10nF-100V  [C0603]
C?#4  0805-100nF-100V  [C0603]
C?#5  0805-1nF-50V  [C0603]
C?#6  0805-1nF-50V  [C0603]
C?#7  0805-1uF-100V  [C0603]
C?#8  0805-100nF-100V  [C0603]
C?#9  100uF/50V  [CAP-SMD_BD6.3-L6.6-W6.6-LS7.6-FD]
C?#10  0805-100nF-50V  [C0603]
C?#11  100uF/35V  [CAP-SMD_BD6.3-L6.6-W6.6-LS7.6-FD]
C?#12  100uF/35V  [CAP-SMD_BD6.3-L6.6-W6.6-LS7.6-FD]
C?#13  0805-100nF-50V  [C0603]
C?#14  0805-100nF-50V  [C0603]
C?#15  0805-100nF-100V  [C0603]
C?#16  100uF/35V  [CAP-SMD_BD6.3-L6.6-W6.6-LS7.6-FD]
C?#17  100uF/35V  [CAP-SMD_BD6.3-L6.6-W6.6-LS7.6-FD]
C?#18  0805-100nF-100V  [C0603]
C?#19  100NF  [C0603]
C?#20  0805-100nF-50V  [C0603]
C?#21  0805-1nF-50V  [C0603]
C?#22  100NF/35V  [CAP-SMD_BD6.3-L6.6-W6.6-LS7.6-FD]
C?#23  100uF/35V  [CAP-SMD_BD6.3-L6.6-W6.6-LS7.6-FD]
C?#24  0805-100nF-100V  [C0603]
C?#25  0805-100nF-100V  [C0603]
C?#26  100NF  [C0603]
C?#27  0805-100nF-50V  [C0603]
C?#28  0805-100nF-50V  [C0603]
C?#29  0805-100nF-50V  [C0603]
C?#30  0805-1nF-50V  [C0603]
C?#31  0805-100nF-50V  [C0603]
C?#32  0805-100nF-50V  [C0603]
C?#33  0805-100nF-50V  [C0603]
C?#34  470uF/35V  [CAP-SMD_BD6.3-L6.6-W6.6-LS7.6-FD]
C?#35  0805-100nF-50V  [C0603]
C?#36  0805-100nF-50V  [C0603]
C?#37  0805-1nF-50V  [C0603]
C?#38  0805-100nF-100V  [C0603]
C?#39  0805-100nF-50V  [C0603]
C?#40  0805-100nF-50V  [C0603]
C?#41  0805-1nF-100V  [C0603]
C?#42  0805-10nF-50V  [C0603]
C?#43  0805-1nF-100V  [C0603]
C?#44  0805-100nF-50V  [C0603]
C?#45  0805-1nF-50V  [C0603]
C?#46  0805-100nF-50V  [C0603]
C?#47  0805-100nF-50V  [C0603]
C?#48  0805-100nF-50V  [C0603]
C?#49  0805-10nF-50V  [C0603]
C?#50  0805-20pF-50V  [C0603]
C?#51  0805-100nF-50V  [C0603]
C?#52  0805-100nF-50V  [C0603]
C?#53  0805-100nF-50V  [C0603]
C?#54  0805-100nF-50V  [C0603]
C?#55  0805-100nF-100V  [C0603]
C?#56  100uF/35V  [CAP-SMD_BD6.3-L6.6-W6.6-LS7.6-FD]
C?#57  0805-20pF-50V  [C0603]
C?#58  0805-10nF-100V  [C0603]
C?#59  0805-1nF-50V  [C0603]
C?#60  0805-10nF-50V  [C0603]
C?#61  0805-100pF-100V  [C0603]
C?#62  0805-100nF-50V  [C0603]
COMP?#1  (no value)  [TEST-TH_BD2.54-P1.4_RED]
COMP?#2  (no value)  [TEST-TH_BD2.54-P1.4_RED]
COMP?#3  (no value)  [TEST-TH_BD2.54-P1.4_RED]
D?#1  1N4148WT  [SOD-523_L1.2-W0.8-LS1.6-FD]
D?#2  1N4148WT  [SOD-523_L1.2-W0.8-LS1.6-FD]
D?#3  1N4148WT  [SOD-523_L1.2-W0.8-LS1.6-FD]
D?#4  1N4148WT  [SOD-523_L1.2-W0.8-LS1.6-FD]
D?#5  1N4148WT  [SOD-523_L1.2-W0.8-LS1.6-FD]
D?#6  ss34  [SMA_L4.3-W2.6-LS5.0-FD]
D?#7  ss34  [SMA_L4.3-W2.6-LS5.0-FD]
D?#8  1N4148WT  [SOD-523_L1.2-W0.8-LS1.6-FD]
D?#9  1N4148WT  [SOD-523_L1.2-W0.8-LS1.6-FD]
D?#10  1N4148WT  [SOD-523_L1.2-W0.8-LS1.6-FD]
D?#11  1N4148WT  [SOD-523_L1.2-W0.8-LS1.6-FD]
D?#12  1N4148WT  [SOD-523_L1.2-W0.8-LS1.6-FD]
D?#13  1N4148WT  [SOD-523_L1.2-W0.8-LS1.6-FD]
D?#14  1N4148WT  [SOD-523_L1.2-W0.8-LS1.6-FD]
D?#15  DIO_LED  [LED0603-RD_RED]  (value not drawn)
D?#16  1N4148WT  [SOD-523_L1.2-W0.8-LS1.6-FD]
D?#17  1N4148WT  [SOD-523_L1.2-W0.8-LS1.6-FD]
D?#18  1N4148WT  [SOD-523_L1.2-W0.8-LS1.6-FD]
D?#19  1N4148WT  [SOD-523_L1.2-W0.8-LS1.6-FD]
D?#20  1N4148WT  [SOD-523_L1.2-W0.8-LS1.6-FD]
D?#21  1N4148WT  [SOD-523_L1.2-W0.8-LS1.6-FD]
D?#22  1N4148WT  [SOD-523_L1.2-W0.8-LS1.6-FD]
D?#23  1N4148WT  [SOD-523_L1.2-W0.8-LS1.6-FD]
D?#24  1N4148WT  [SOD-523_L1.2-W0.8-LS1.6-FD]
D?#25  1N4148WT  [SOD-523_L1.2-W0.8-LS1.6-FD]
D?#26  1N4148WT  [SOD-523_L1.2-W0.8-LS1.6-FD]
D?#27  1N4148WT  [SOD-523_L1.2-W0.8-LS1.6-FD]
D?#28  1N4148WT  [SOD-523_L1.2-W0.8-LS1.6-FD]
D?#29  1N4148WT  [SOD-523_L1.2-W0.8-LS1.6-FD]
D?#30  1N4148WT  [SOD-523_L1.2-W0.8-LS1.6-FD]
D?#31  1N4148WT  [SOD-523_L1.2-W0.8-LS1.6-FD]
D?#32  1N4148WT  [SOD-523_L1.2-W0.8-LS1.6-FD]
D?#33  1N4148WT  [SOD-523_L1.2-W0.8-LS1.6-FD]
D?#34  1N4148WT  [SOD-523_L1.2-W0.8-LS1.6-FD]
D?#35  1N4148WT  [SOD-523_L1.2-W0.8-LS1.6-FD]
D?#36  1N4148WT  [SOD-523_L1.2-W0.8-LS1.6-FD]
D?#37  1N4148WT  [SOD-523_L1.2-W0.8-LS1.6-FD]
D?#38  1N4148WT  [SOD-523_L1.2-W0.8-LS1.6-FD]
D?#39  1N4148WT  [SOD-523_L1.2-W0.8-LS1.6-FD]
D?#40  1N4148WT  [SOD-523_L1.2-W0.8-LS1.6-FD]
D?#41  1N4148WT  [SOD-523_L1.2-W0.8-LS1.6-FD]
D?#42  1N4148WT  [SOD-523_L1.2-W0.8-LS1.6-FD]
D?#43  1N4148WT  [SOD-523_L1.2-W0.8-LS1.6-FD]
D?#44  1N4148WT  [SOD-523_L1.2-W0.8-LS1.6-FD]
D?#45  1N4148WT  [SOD-523_L1.2-W0.8-LS1.6-FD]
D?#46  1N4148WT  [SOD-523_L1.2-W0.8-LS1.6-FD]
D?#47  1N4148WT  [SOD-523_L1.2-W0.8-LS1.6-FD]
D?#48  1N4148WT  [SOD-523_L1.2-W0.8-LS1.6-FD]
D?#49  1N4148WT  [SOD-523_L1.2-W0.8-LS1.6-FD]
D?#50  1N4148WT  [SOD-523_L1.2-W0.8-LS1.6-FD]
D?#51  1N4148WT  [SOD-523_L1.2-W0.8-LS1.6-FD]
H?#1  pz254v-11-02p  [HDR-TH_2P-P2.54-V-M]  (value not drawn)
H?#2  pz254v-11-02p  [HDR-TH_2P-P2.54-V-M]  (value not drawn)
H?#3  pz254v-11-02p  [HDR-TH_2P-P2.54-V-M]  (value not drawn)
H?#4  pz254v-11-02p  [HDR-TH_2P-P2.54-V-M]  (value not drawn)
H?#5  pz254v-11-02p  [HDR-TH_2P-P2.54-V-M]  (value not drawn)
H?#6  pz254v-11-02p  [HDR-TH_2P-P2.54-V-M]  (value not drawn)
H?#7  pz254v-11-02p  [HDR-TH_2P-P2.54-V-M]  (value not drawn)
H?#8  pz254v-11-02p  [HDR-TH_2P-P2.54-V-M]  (value not drawn)
H?#9  pz254v-11-02p  [HDR-TH_2P-P2.54-V-M]  (value not drawn)
H?#10  pz254v-11-02p  [HDR-TH_2P-P2.54-V-M]  (value not drawn)
H?#11  pz254v-11-02p  [HDR-TH_2P-P2.54-V-M]  (value not drawn)
H?#12  pz254v-11-02p  [HDR-TH_2P-P2.54-V-M]  (value not drawn)
H?#13  pz254v-11-02p  [HDR-TH_2P-P2.54-V-M]  (value not drawn)
H?#14  pz254v-11-02p  [HDR-TH_2P-P2.54-V-M]  (value not drawn)
H?#15  pz254v-11-02p  [HDR-TH_2P-P2.54-V-M]  (value not drawn)
H?#16  pz254v-11-02p  [HDR-TH_2P-P2.54-V-M]  (value not drawn)
H?#17  pz254v-11-02p  [HDR-TH_2P-P2.54-V-M]  (value not drawn)
H?#18  pz254v-11-02p  [HDR-TH_2P-P2.54-V-M]  (value not drawn)
H?#19  pz254v-11-02p  [HDR-TH_2P-P2.54-V-M]  (value not drawn)
H?#20  pz254v-11-02p  [HDR-TH_2P-P2.54-V-M]  (value not drawn)
H?#21  pz254v-11-02p  [HDR-TH_2P-P2.54-V-M]  (value not drawn)
H?#22  pz254v-11-02p  [HDR-TH_2P-P2.54-V-M]  (value not drawn)
H?#23  pz254v-11-02p  [HDR-TH_2P-P2.54-V-M]  (value not drawn)
H?#24  pz254v-11-02p  [HDR-TH_2P-P2.54-V-M]  (value not drawn)
H?#25  pz254v-11-02p  [HDR-TH_2P-P2.54-V-M]  (value not drawn)
H?#26  pz254v-11-02p  [HDR-TH_2P-P2.54-V-M]  (value not drawn)
H?#27  pz254v-11-02p  [HDR-TH_2P-P2.54-V-M]  (value not drawn)
H?#28  pz254v-11-02p  [HDR-TH_2P-P2.54-V-M]  (value not drawn)
H?#29  pz254v-11-02p  [HDR-TH_2P-P2.54-V-M]  (value not drawn)
H?#30  pz254v-11-02p  [HDR-TH_2P-P2.54-V-M]  (value not drawn)
H?#31  pz254v-11-02p  [HDR-TH_2P-P2.54-V-M]  (value not drawn)
H?#32  pz254v-11-02p  [HDR-TH_2P-P2.54-V-M]  (value not drawn)
H?#33  pz254v-11-02p  [HDR-TH_2P-P2.54-V-M]  (value not drawn)
H?#34  pz254v-11-02p  [HDR-TH_2P-P2.54-V-M]  (value not drawn)
H?#35  pz254v-11-02p  [HDR-TH_2P-P2.54-V-M]  (value not drawn)
H?#36  pz254v-11-02p  [HDR-TH_2P-P2.54-V-M]  (value not drawn)
H?#37  pz254v-11-02p  [HDR-TH_2P-P2.54-V-M]  (value not drawn)
H?#38  pz254v-11-02p  [HDR-TH_2P-P2.54-V-M]  (value not drawn)
H?#39  pz254v-11-02p  [HDR-TH_2P-P2.54-V-M]  (value not drawn)
H?#40  pz254v-11-02p  [HDR-TH_2P-P2.54-V-M]  (value not drawn)
H?#41  pz254v-11-02p  [HDR-TH_2P-P2.54-V-M]  (value not drawn)
H?#42  pz254v-11-02p  [HDR-TH_2P-P2.54-V-M]  (value not drawn)
H?#43  pz254v-11-02p  [HDR-TH_2P-P2.54-V-M]  (value not drawn)
H?#44  pz254v-11-02p  [HDR-TH_2P-P2.54-V-M]  (value not drawn)
H?#45  pz254v-11-02p  [HDR-TH_2P-P2.54-V-M]  (value not drawn)
H?#46  pz254v-11-02p  [HDR-TH_2P-P2.54-V-M]  (value not drawn)
H?#47  pz254v-11-02p  [HDR-TH_2P-P2.54-V-M]  (value not drawn)
H?#48  pz254v-11-02p  [HDR-TH_2P-P2.54-V-M]  (value not drawn)
H?#49  pz254v-11-02p  [HDR-TH_2P-P2.54-V-M]  (value not drawn)
H?#50  pz254v-11-02p  [HDR-TH_2P-P2.54-V-M]  (value not drawn)
H?#51  pz254v-11-02p  [HDR-TH_2P-P2.54-V-M]  (value not drawn)
H?#52  pz254v-11-02p  [HDR-TH_2P-P2.54-V-M]  (value not drawn)
H?#53  pz254v-11-02p  [HDR-TH_2P-P2.54-V-M]  (value not drawn)
H?#54  pz254v-11-02p  [HDR-TH_2P-P2.54-V-M]  (value not drawn)
H?#55  pz254v-11-02p  [HDR-TH_2P-P2.54-V-M]  (value not drawn)
H?#56  pz254v-11-02p  [HDR-TH_2P-P2.54-V-M]  (value not drawn)
H?#57  pz254v-11-02p  [HDR-TH_2P-P2.54-V-M]  (value not drawn)
H?#58  pz254v-11-02p  [HDR-TH_2P-P2.54-V-M]  (value not drawn)
H?#59  pz254v-11-02p  [HDR-TH_2P-P2.54-V-M]  (value not drawn)
H?#60  pz254v-11-02p  [HDR-TH_2P-P2.54-V-M]  (value not drawn)
H?#61  pz254v-11-02p  [HDR-TH_2P-P2.54-V-M]  (value not drawn)
N?#1  MMTB3904  [SOT-23-3_L2.9-W1.3-P1.90-LS2.4-BR - duplicate]
N?#2  (no value)  [TEST-TH_BD2.54-P1.4_RED]
N?#3  MMTB3904  [SOT-23-3_L2.9-W1.3-P1.90-LS2.4-BR - duplicate]
N?#4  (no value)  [TEST-TH_BD2.54-P1.4_RED]
N?#5  (no value)  [TEST-TH_BD2.54-P1.4_RED]
N?#6  MMTB3904  [SOT-23-3_L2.9-W1.3-P1.90-LS2.4-BR - duplicate]
N?#7  (no value)  [TEST-TH_BD2.54-P1.4_RED]
N?#8  MMTB3904  [SOT-23-3_L2.9-W1.3-P1.90-LS2.4-BR - duplicate]
N?#9  MMTB3904  [SOT-23-3_L2.9-W1.3-P1.90-LS2.4-BR - duplicate]
N?#10  (no value)  [TEST-TH_BD2.54-P1.4_RED]
N?#11  (no value)  [TEST-TH_BD2.54-P1.4_RED]
N?#12  (no value)  [TEST-TH_BD2.54-P1.4_RED]
N?#13  MMTB3904  [SOT-23-3_L2.9-W1.3-P1.90-LS2.4-BR - duplicate]
N?#14  MMTB3904  [SOT-23-3_L2.9-W1.3-P1.90-LS2.4-BR - duplicate]
N?#15  (no value)  [TEST-TH_BD2.54-P1.4_RED]
N?#16  (no value)  [TEST-TH_BD2.54-P1.4_RED]
N?#17  2sd882  [TO-126-3_L7.6-W2.7-P2.29-R]
N?#18  MMTB3904  [SOT-23-3_L2.9-W1.3-P1.90-LS2.4-BR - duplicate]
N?#19  2sd882  [TO-126-3_L7.6-W2.7-P2.29-R]
N?#20  2sd882  [TO-126-3_L7.6-W2.7-P2.29-R]
N?#21  MMTB3904  [SOT-23-3_L2.9-W1.3-P1.90-LS2.4-BR - duplicate]
N?#22  MMTB3904  [SOT-23-3_L2.9-W1.3-P1.90-LS2.4-BR - duplicate]
N?#23  2sd882  [TO-126-3_L7.6-W2.7-P2.29-R]
N?#24  MMTB3904  [SOT-23-3_L2.9-W1.3-P1.90-LS2.4-BR - duplicate]
N?#25  MMTB3904  [SOT-23-3_L2.9-W1.3-P1.90-LS2.4-BR - duplicate]
N?#26  (no value)  [TEST-TH_BD2.54-P1.4_RED]
N?#27  MMTB3904  [SOT-23-3_L2.9-W1.3-P1.90-LS2.4-BR - duplicate]
N?#28  (no value)  [TEST-TH_BD2.54-P1.4_RED]
N?#29  MMTB3904  [SOT-23-3_L2.9-W1.3-P1.90-LS2.4-BR - duplicate]
N?#30  MMTB3904  [SOT-23-3_L2.9-W1.3-P1.90-LS2.4-BR - duplicate]
N?#31  MMTB3904  [SOT-23-3_L2.9-W1.3-P1.90-LS2.4-BR - duplicate]
N?#32  MMTB3904  [SOT-23-3_L2.9-W1.3-P1.90-LS2.4-BR - duplicate]
N?#33  MMTB3904  [SOT-23-3_L2.9-W1.3-P1.90-LS2.4-BR - duplicate]
N?#34  MMTB3904  [SOT-23-3_L2.9-W1.3-P1.90-LS2.4-BR - duplicate]
N?#35  MMTB3904  [SOT-23-3_L2.9-W1.3-P1.90-LS2.4-BR - duplicate]
N?#36  (no value)  [TEST-TH_BD2.54-P1.4_RED]
N?#37  (no value)  [TEST-TH_BD2.54-P1.4_RED]
N?#38  MMTB3904  [SOT-23-3_L2.9-W1.3-P1.90-LS2.4-BR - duplicate]
N?#39  MMTB3904  [SOT-23-3_L2.9-W1.3-P1.90-LS2.4-BR - duplicate]
N?#40  MMTB3904  [SOT-23-3_L2.9-W1.3-P1.90-LS2.4-BR - duplicate]
N?#41  MMTB3904  [SOT-23-3_L2.9-W1.3-P1.90-LS2.4-BR - duplicate]
N?#42  MMTB3904  [SOT-23-3_L2.9-W1.3-P1.90-LS2.4-BR - duplicate]
N?#43  MMTB3904  [SOT-23-3_L2.9-W1.3-P1.90-LS2.4-BR - duplicate]
N?#44  MMTB3904  [SOT-23-3_L2.9-W1.3-P1.90-LS2.4-BR - duplicate]
N?#45  MMTB3904  [SOT-23-3_L2.9-W1.3-P1.90-LS2.4-BR - duplicate]
N?#46  MMTB3904  [SOT-23-3_L2.9-W1.3-P1.90-LS2.4-BR - duplicate]
N?#47  MMTB3904  [SOT-23-3_L2.9-W1.3-P1.90-LS2.4-BR - duplicate]
N?#48  MMTB3904  [SOT-23-3_L2.9-W1.3-P1.90-LS2.4-BR - duplicate]
N?#49  MMTB3904  [SOT-23-3_L2.9-W1.3-P1.90-LS2.4-BR - duplicate]
N?#50  MMTB3904  [SOT-23-3_L2.9-W1.3-P1.90-LS2.4-BR - duplicate]
N?#51  MMTB3904  [SOT-23-3_L2.9-W1.3-P1.90-LS2.4-BR - duplicate]
N?#52  MMTB3904  [SOT-23-3_L2.9-W1.3-P1.90-LS2.4-BR - duplicate]
N?#53  (no value)  [TEST-TH_BD2.54-P1.4_RED]
N?#54  MMTB3904  [SOT-23-3_L2.9-W1.3-P1.90-LS2.4-BR - duplicate]
N?#55  MMTB3904  [SOT-23-3_L2.9-W1.3-P1.90-LS2.4-BR - duplicate]
N?#56  MMTB3904  [SOT-23-3_L2.9-W1.3-P1.90-LS2.4-BR - duplicate]
N?#57  MMTB3904  [SOT-23-3_L2.9-W1.3-P1.90-LS2.4-BR - duplicate]
N?#58  MMTB3904  [SOT-23-3_L2.9-W1.3-P1.90-LS2.4-BR - duplicate]
N?#59  (no value)  [TEST-TH_BD2.54-P1.4_RED]
N?#60  MMTB3904  [SOT-23-3_L2.9-W1.3-P1.90-LS2.4-BR - duplicate]
N?#61  (no value)  [TEST-TH_BD2.54-P1.4_RED]
N?#62  MMTB3904  [SOT-23-3_L2.9-W1.3-P1.90-LS2.4-BR - duplicate]
N?#63  (no value)  [TEST-TH_BD2.54-P1.4_RED]
N?#64  (no value)  [TEST-TH_BD2.54-P1.4_RED]
N?#65  MMTB3904  [SOT-23-3_L2.9-W1.3-P1.90-LS2.4-BR - duplicate]
N?#66  (no value)  [TEST-TH_BD2.54-P1.4_RED]
N?#67  MMTB3904  [SOT-23-3_L2.9-W1.3-P1.90-LS2.4-BR - duplicate]
N?#68  MMTB3904  [SOT-23-3_L2.9-W1.3-P1.90-LS2.4-BR - duplicate]
N?#69  (no value)  [TEST-TH_BD2.54-P1.4_RED]
N?#70  MMTB3904  [SOT-23-3_L2.9-W1.3-P1.90-LS2.4-BR - duplicate]
N?#71  MMTB3904  [SOT-23-3_L2.9-W1.3-P1.90-LS2.4-BR - duplicate]
N?#72  MMTB3904  [SOT-23-3_L2.9-W1.3-P1.90-LS2.4-BR - duplicate]
N?#73  (no value)  [TEST-TH_BD2.54-P1.4_RED]
N?#74  MMTB3904  [SOT-23-3_L2.9-W1.3-P1.90-LS2.4-BR - duplicate]
N?#75  MMTB3904  [SOT-23-3_L2.9-W1.3-P1.90-LS2.4-BR - duplicate]
N?#76  (no value)  [TEST-TH_BD2.54-P1.4_RED]
N?#77  MMTB3904  [SOT-23-3_L2.9-W1.3-P1.90-LS2.4-BR - duplicate]
N?#78  MMTB3904  [SOT-23-3_L2.9-W1.3-P1.90-LS2.4-BR - duplicate]
N?#79  MMTB3904  [SOT-23-3_L2.9-W1.3-P1.90-LS2.4-BR - duplicate]
N?#80  MMTB3904  [SOT-23-3_L2.9-W1.3-P1.90-LS2.4-BR - duplicate]
N?#81  (no value)  [TEST-TH_BD2.54-P1.4_RED]
N?#82  MMTB3904  [SOT-23-3_L2.9-W1.3-P1.90-LS2.4-BR - duplicate]
N?#83  (no value)  [TEST-TH_BD2.54-P1.4_RED]
N?#84  MMTB3904  [SOT-23-3_L2.9-W1.3-P1.90-LS2.4-BR - duplicate]
N?#85  MMTB3904  [SOT-23-3_L2.9-W1.3-P1.90-LS2.4-BR - duplicate]
N?#86  (no value)  [TEST-TH_BD2.54-P1.4_RED]
N?#87  (no value)  [TEST-TH_BD2.54-P1.4_RED]
N?#88  MMTB3904  [SOT-23-3_L2.9-W1.3-P1.90-LS2.4-BR - duplicate]
N?#89  (no value)  [TEST-TH_BD2.54-P1.4_RED]
N?#90  (no value)  [TEST-TH_BD2.54-P1.4_RED]
N?#91  MMTB3904  [SOT-23-3_L2.9-W1.3-P1.90-LS2.4-BR - duplicate]
N?#92  MMTB3904  [SOT-23-3_L2.9-W1.3-P1.90-LS2.4-BR - duplicate]
N?#93  (no value)  [TEST-TH_BD2.54-P1.4_RED]
N?#94  (no value)  [TEST-TH_BD2.54-P1.4_RED]
N?#95  MMTB3904  [SOT-23-3_L2.9-W1.3-P1.90-LS2.4-BR - duplicate]
N?#96  MMTB3904  [SOT-23-3_L2.9-W1.3-P1.90-LS2.4-BR - duplicate]
N?#97  (no value)  [TEST-TH_BD2.54-P1.4_RED]
N?#98  MMTB3904  [SOT-23-3_L2.9-W1.3-P1.90-LS2.4-BR - duplicate]
N?#99  MMTB3904  [SOT-23-3_L2.9-W1.3-P1.90-LS2.4-BR - duplicate]
N?#100  MMTB3904  [SOT-23-3_L2.9-W1.3-P1.90-LS2.4-BR - duplicate]
N?#101  (no value)  [TEST-TH_BD2.54-P1.4_RED]
N?#102  MMTB3904  [SOT-23-3_L2.9-W1.3-P1.90-LS2.4-BR - duplicate]
N?#103  (no value)  [TEST-TH_BD2.54-P1.4_RED]
N?#104  MMTB3904  [SOT-23-3_L2.9-W1.3-P1.90-LS2.4-BR - duplicate]
N?#105  MMTB3904  [SOT-23-3_L2.9-W1.3-P1.90-LS2.4-BR - duplicate]
N?#106  MMTB3904  [SOT-23-3_L2.9-W1.3-P1.90-LS2.4-BR - duplicate]
N?#107  MMTB3904  [SOT-23-3_L2.9-W1.3-P1.90-LS2.4-BR - duplicate]
N?#108  MMTB3904  [SOT-23-3_L2.9-W1.3-P1.90-LS2.4-BR - duplicate]
N?#109  (no value)  [TEST-TH_BD2.54-P1.4_RED]
N?#110  MMTB3904  [SOT-23-3_L2.9-W1.3-P1.90-LS2.4-BR - duplicate]
N?#111  MMTB3904  [SOT-23-3_L2.9-W1.3-P1.90-LS2.4-BR - duplicate]
N?#112  MMTB3904  [SOT-23-3_L2.9-W1.3-P1.90-LS2.4-BR - duplicate]
N?#113  MMTB3904  [SOT-23-3_L2.9-W1.3-P1.90-LS2.4-BR - duplicate]
N?#114  MMTB3904  [SOT-23-3_L2.9-W1.3-P1.90-LS2.4-BR - duplicate]
N?#115  (no value)  [TEST-TH_BD2.54-P1.4_RED]
N?#116  MMTB3904  [SOT-23-3_L2.9-W1.3-P1.90-LS2.4-BR - duplicate]
N?#117  MMTB3904  [SOT-23-3_L2.9-W1.3-P1.90-LS2.4-BR - duplicate]
N?#118  (no value)  [TEST-TH_BD2.54-P1.4_RED]
N?#119  MMTB3904  [SOT-23-3_L2.9-W1.3-P1.90-LS2.4-BR - duplicate]
N?#120  MMTB3904  [SOT-23-3_L2.9-W1.3-P1.90-LS2.4-BR - duplicate]
N?#121  MMTB3904  [SOT-23-3_L2.9-W1.3-P1.90-LS2.4-BR - duplicate]
N?#122  (no value)  [TEST-TH_BD2.54-P1.4_RED]
N?#123  MMTB3904  [SOT-23-3_L2.9-W1.3-P1.90-LS2.4-BR - duplicate]
N?#124  MMTB3904  [SOT-23-3_L2.9-W1.3-P1.90-LS2.4-BR - duplicate]
N?#125  MMTB3904  [SOT-23-3_L2.9-W1.3-P1.90-LS2.4-BR - duplicate]
N?#126  MMTB3904  [SOT-23-3_L2.9-W1.3-P1.90-LS2.4-BR - duplicate]
N?#127  MMTB3904  [SOT-23-3_L2.9-W1.3-P1.90-LS2.4-BR - duplicate]
N?#128  (no value)  [TEST-TH_BD2.54-P1.4_RED]
N?#129  MMTB3904  [SOT-23-3_L2.9-W1.3-P1.90-LS2.4-BR - duplicate]
N?#130  (no value)  [TEST-TH_BD2.54-P1.4_RED]
N?#131  MMTB3904  [SOT-23-3_L2.9-W1.3-P1.90-LS2.4-BR - duplicate]
N?#132  (no value)  [TEST-TH_BD2.54-P1.4_RED]
N?#133  MMTB3904  [SOT-23-3_L2.9-W1.3-P1.90-LS2.4-BR - duplicate]
N?#134  MMTB3904  [SOT-23-3_L2.9-W1.3-P1.90-LS2.4-BR - duplicate]
N?#135  (no value)  [TEST-TH_BD2.54-P1.4_RED]
N?#136  (no value)  [TEST-TH_BD2.54-P1.4_RED]
N?#137  MMTB3904  [SOT-23-3_L2.9-W1.3-P1.90-LS2.4-BR - duplicate]
N?#138  MMTB3904  [SOT-23-3_L2.9-W1.3-P1.90-LS2.4-BR - duplicate]
N?#139  MMTB3904  [SOT-23-3_L2.9-W1.3-P1.90-LS2.4-BR - duplicate]
N?#140  MMTB3904  [SOT-23-3_L2.9-W1.3-P1.90-LS2.4-BR - duplicate]
N?#141  MMTB3904  [SOT-23-3_L2.9-W1.3-P1.90-LS2.4-BR - duplicate]
N?#142  MMTB3904  [SOT-23-3_L2.9-W1.3-P1.90-LS2.4-BR - duplicate]
N?#143  (no value)  [TEST-TH_BD2.54-P1.4_RED]
N?#144  MMTB3904  [SOT-23-3_L2.9-W1.3-P1.90-LS2.4-BR - duplicate]
N?#145  (no value)  [TEST-TH_BD2.54-P1.4_RED]
N?#146  MMTB3904  [SOT-23-3_L2.9-W1.3-P1.90-LS2.4-BR - duplicate]
N?#147  (no value)  [TEST-TH_BD2.54-P1.4_RED]
N?#148  (no value)  [TEST-TH_BD2.54-P1.4_RED]
N?#149  MMTB3904  [SOT-23-3_L2.9-W1.3-P1.90-LS2.4-BR - duplicate]
N?#150  MMTB3904  [SOT-23-3_L2.9-W1.3-P1.90-LS2.4-BR - duplicate]
N?#151  MMTB3904  [SOT-23-3_L2.9-W1.3-P1.90-LS2.4-BR - duplicate]
N?#152  MMTB3904  [SOT-23-3_L2.9-W1.3-P1.90-LS2.4-BR - duplicate]
N?#153  MMTB3904  [SOT-23-3_L2.9-W1.3-P1.90-LS2.4-BR - duplicate]
N?#154  MMTB3904  [SOT-23-3_L2.9-W1.3-P1.90-LS2.4-BR - duplicate]
N?#155  (no value)  [TEST-TH_BD2.54-P1.4_RED]
N?#156  (no value)  [TEST-TH_BD2.54-P1.4_RED]
N?#157  MMTB3904  [SOT-23-3_L2.9-W1.3-P1.90-LS2.4-BR - duplicate]
N?#158  MMTB3904  [SOT-23-3_L2.9-W1.3-P1.90-LS2.4-BR - duplicate]
N?#159  (no value)  [TEST-TH_BD2.54-P1.4_RED]
N?#160  MMTB3904  [SOT-23-3_L2.9-W1.3-P1.90-LS2.4-BR - duplicate]
N?#161  MMTB3904  [SOT-23-3_L2.9-W1.3-P1.90-LS2.4-BR - duplicate]
N?#162  MMTB3904  [SOT-23-3_L2.9-W1.3-P1.90-LS2.4-BR - duplicate]
N?#163  MMTB3904  [SOT-23-3_L2.9-W1.3-P1.90-LS2.4-BR - duplicate]
N?#164  MMTB3904  [SOT-23-3_L2.9-W1.3-P1.90-LS2.4-BR - duplicate]
N?#165  (no value)  [TEST-TH_BD2.54-P1.4_RED]
N?#166  MMTB3904  [SOT-23-3_L2.9-W1.3-P1.90-LS2.4-BR - duplicate]
N?#167  (no value)  [TEST-TH_BD2.54-P1.4_RED]
N?#168  (no value)  [TEST-TH_BD2.54-P1.4_RED]
N?#169  (no value)  [TEST-TH_BD2.54-P1.4_RED]
N?#170  MMTB3904  [SOT-23-3_L2.9-W1.3-P1.90-LS2.4-BR - duplicate]
N?#171  MMTB3904  [SOT-23-3_L2.9-W1.3-P1.90-LS2.4-BR - duplicate]
N?#172  (no value)  [TEST-TH_BD2.54-P1.4_RED]
N?#173  (no value)  [TEST-TH_BD2.54-P1.4_RED]
N?#174  (no value)  [TEST-TH_BD2.54-P1.4_RED]
N?#175  MMTB3904  [SOT-23-3_L2.9-W1.3-P1.90-LS2.4-BR - duplicate]
N?#176  MMTB3904  [SOT-23-3_L2.9-W1.3-P1.90-LS2.4-BR - duplicate]
N?#177  MMTB3904  [SOT-23-3_L2.9-W1.3-P1.90-LS2.4-BR - duplicate]
N?#178  MMTB3904  [SOT-23-3_L2.9-W1.3-P1.90-LS2.4-BR - duplicate]
N?#179  MMTB3904  [SOT-23-3_L2.9-W1.3-P1.90-LS2.4-BR - duplicate]
N?#180  MMTB3904  [SOT-23-3_L2.9-W1.3-P1.90-LS2.4-BR - duplicate]
N?#181  MMTB3904  [SOT-23-3_L2.9-W1.3-P1.90-LS2.4-BR - duplicate]
N?#182  MMTB3904  [SOT-23-3_L2.9-W1.3-P1.90-LS2.4-BR - duplicate]
N?#183  (no value)  [TEST-TH_BD2.54-P1.4_RED]
N?#184  MMTB3904  [SOT-23-3_L2.9-W1.3-P1.90-LS2.4-BR - duplicate]
N?#185  (no value)  [TEST-TH_BD2.54-P1.4_RED]
N?#186  MMTB3904  [SOT-23-3_L2.9-W1.3-P1.90-LS2.4-BR - duplicate]
N?#187  MMTB3904  [SOT-23-3_L2.9-W1.3-P1.90-LS2.4-BR - duplicate]
N?#188  (no value)  [TEST-TH_BD2.54-P1.4_RED]
N?#189  (no value)  [TEST-TH_BD2.54-P1.4_RED]
N?#190  MMTB3904  [SOT-23-3_L2.9-W1.3-P1.90-LS2.4-BR - duplicate]
N?#191  (no value)  [TEST-TH_BD2.54-P1.4_RED]
N?#192  MMTB3904  [SOT-23-3_L2.9-W1.3-P1.90-LS2.4-BR - duplicate]
N?#193  MMTB3904  [SOT-23-3_L2.9-W1.3-P1.90-LS2.4-BR - duplicate]
N?#194  (no value)  [TEST-TH_BD2.54-P1.4_RED]
N?#195  MMTB3904  [SOT-23-3_L2.9-W1.3-P1.90-LS2.4-BR - duplicate]
N?#196  MMTB3904  [SOT-23-3_L2.9-W1.3-P1.90-LS2.4-BR - duplicate]
N?#197  (no value)  [TEST-TH_BD2.54-P1.4_RED]
N?#198  MMTB3904  [SOT-23-3_L2.9-W1.3-P1.90-LS2.4-BR - duplicate]
N?#199  MMTB3904  [SOT-23-3_L2.9-W1.3-P1.90-LS2.4-BR - duplicate]
P?#1  MMBT3906  [SOT-23-3_L2.9-W1.3-P1.90-LS2.4-BR]
P?#2  MMBT3906  [SOT-23-3_L2.9-W1.3-P1.90-LS2.4-BR]
P?#3  MMBT3906  [SOT-23-3_L2.9-W1.3-P1.90-LS2.4-BR]
P?#4  MMBT3906  [SOT-23-3_L2.9-W1.3-P1.90-LS2.4-BR]
P?#5  MMBT3906  [SOT-23-3_L2.9-W1.3-P1.90-LS2.4-BR]
P?#6  MMBT3906  [SOT-23-3_L2.9-W1.3-P1.90-LS2.4-BR]
P?#7  MMBT3906  [SOT-23-3_L2.9-W1.3-P1.90-LS2.4-BR]
P?#8  MMBT3906  [SOT-23-3_L2.9-W1.3-P1.90-LS2.4-BR]
P?#9  MMBT3906  [SOT-23-3_L2.9-W1.3-P1.90-LS2.4-BR]
P?#10  B772  [SOT-89-3_L4.5-W2.5-P1.50-LS4.2-BR]
P?#11  MMBT3906  [SOT-23-3_L2.9-W1.3-P1.90-LS2.4-BR]
P?#12  MMBT3906  [SOT-23-3_L2.9-W1.3-P1.90-LS2.4-BR]
P?#13  MMBT3906  [SOT-23-3_L2.9-W1.3-P1.90-LS2.4-BR]
P?#14  MMBT3906  [SOT-23-3_L2.9-W1.3-P1.90-LS2.4-BR]
P?#15  MMBT3906  [SOT-23-3_L2.9-W1.3-P1.90-LS2.4-BR]
P?#16  MMBT3906  [SOT-23-3_L2.9-W1.3-P1.90-LS2.4-BR]
P?#17  MMBT3906  [SOT-23-3_L2.9-W1.3-P1.90-LS2.4-BR]
P?#18  MMBT3906  [SOT-23-3_L2.9-W1.3-P1.90-LS2.4-BR]
P?#19  MMBT3906  [SOT-23-3_L2.9-W1.3-P1.90-LS2.4-BR]
P?#20  MMBT3906  [SOT-23-3_L2.9-W1.3-P1.90-LS2.4-BR]
P?#21  MMBT3906  [SOT-23-3_L2.9-W1.3-P1.90-LS2.4-BR]
P?#22  MMBT3906  [SOT-23-3_L2.9-W1.3-P1.90-LS2.4-BR]
P?#23  MMBT3906  [SOT-23-3_L2.9-W1.3-P1.90-LS2.4-BR]
P?#24  MMBT3906  [SOT-23-3_L2.9-W1.3-P1.90-LS2.4-BR]
P?#25  MMBT3906  [SOT-23-3_L2.9-W1.3-P1.90-LS2.4-BR]
P?#26  MMBT3906  [SOT-23-3_L2.9-W1.3-P1.90-LS2.4-BR]
P?#27  MMBT3906  [SOT-23-3_L2.9-W1.3-P1.90-LS2.4-BR]
P?#28  MMBT3906  [SOT-23-3_L2.9-W1.3-P1.90-LS2.4-BR]
P?#29  MMBT3906  [SOT-23-3_L2.9-W1.3-P1.90-LS2.4-BR]
P?#30  MMBT3906  [SOT-23-3_L2.9-W1.3-P1.90-LS2.4-BR]
P?#31  MMBT3906  [SOT-23-3_L2.9-W1.3-P1.90-LS2.4-BR]
P?#32  MMBT3906  [SOT-23-3_L2.9-W1.3-P1.90-LS2.4-BR]
P?#33  MMBT3906  [SOT-23-3_L2.9-W1.3-P1.90-LS2.4-BR]
P?#34  MMBT3906  [SOT-23-3_L2.9-W1.3-P1.90-LS2.4-BR]
P?#35  MMBT3906  [SOT-23-3_L2.9-W1.3-P1.90-LS2.4-BR]
P?#36  MMBT3906  [SOT-23-3_L2.9-W1.3-P1.90-LS2.4-BR]  (value not drawn)
P?#37  MMBT3906  [SOT-23-3_L2.9-W1.3-P1.90-LS2.4-BR]
P?#38  MMBT3906  [SOT-23-3_L2.9-W1.3-P1.90-LS2.4-BR]
P?#39  MMBT3906  [SOT-23-3_L2.9-W1.3-P1.90-LS2.4-BR]
P?#40  MMBT3906  [SOT-23-3_L2.9-W1.3-P1.90-LS2.4-BR]
P?#41  MMBT3906  [SOT-23-3_L2.9-W1.3-P1.90-LS2.4-BR]
P?#42  MMBT3906  [SOT-23-3_L2.9-W1.3-P1.90-LS2.4-BR]
P?#43  MMBT3906  [SOT-23-3_L2.9-W1.3-P1.90-LS2.4-BR]
P?#44  MMBT3906  [SOT-23-3_L2.9-W1.3-P1.90-LS2.4-BR]
P?#45  MMBT3906  [SOT-23-3_L2.9-W1.3-P1.90-LS2.4-BR]
P?#46  MMBT3906  [SOT-23-3_L2.9-W1.3-P1.90-LS2.4-BR]
P?#47  MMBT3906  [SOT-23-3_L2.9-W1.3-P1.90-LS2.4-BR]
P?#48  MMBT3906  [SOT-23-3_L2.9-W1.3-P1.90-LS2.4-BR]
Q?#1  do4085a  [SOT-23-3_L2.9-W1.6-P1.90-LS2.8-BR]
Q?#2  aod4185  [TO-252-3_L6.6-W6.1-P4.57-LS9.9-BR-CW]
Q?#3  MMTB3904  [SOT-23-3_L2.9-W1.3-P1.90-LS2.4-BR - duplicate]
Q?#4  MMTB3904  [SOT-23-3_L2.9-W1.3-P1.90-LS2.4-BR - duplicate]
Q?#5  50n04  [TO-252-2_L6.6-W6.1-P4.57-LS9.9-BR-CW]
Q?#6  50n04  [TO-252-2_L6.6-W6.1-P4.57-LS9.9-BR-CW]
Q?#7  MMBT3906  [SOT-23-3_L2.9-W1.3-P1.90-LS2.4-BR]
Q?#8  MMBT3906  [SOT-23-3_L2.9-W1.3-P1.90-LS2.4-BR]
Q?#9  MMBT3906  [SOT-23-3_L2.9-W1.3-P1.90-LS2.4-BR]
R?#1  0805-680Ω-5%  [R0603]
R?#2  0805-1KΩ-5%  [R0603]
R?#3  0805-820Ω-5%  [R0603]
R?#4  0805-5.6KΩ-5%  [R0603]
R?#5  0805-820Ω-5%  [R0603]
R?#6  0805-4.7KΩ-5%  [R0603]
R?#7  0805-10K-5%  [R0603]
R?#8  0805-2KΩ-5%  [R0603]
R?#9  0805-10K-5%  [R0603]
R?#10  0805-2KΩ-5%  [R0603]
R?#11  0805-20KΩ-5%  [R0603]
R?#12  0805-10KΩ-5%  [R0603]
R?#13  0805-6.2KΩ-5%  [R0603]
R?#14  0805-100Ω-5%  [R0603]
R?#15  0805-100Ω-5%  [R0603]
R?#16  0805-100Ω-5%  [R0603]
R?#17  0805-100Ω-5%  [R0603]
R?#18  0805-100Ω-5%  [R0603]
R?#19  0805-100KΩ-5%  [R0603]
R?#20  0805-6KΩ-5%  [R0603]
R?#21  0805-6KΩ-5%  [R0603]
R?#22  0805-10kΩ-5%  [R0603]
R?#23  0805-100KΩ-5%  [R0603]
R?#24  0805-100Ω-5%  [R0603]
R?#25  0805-100Ω-5%  [R0603]
R?#26  0805-100Ω-5%  [R0603]
R?#27  0805-5.1KΩ-5%  [R0603]
R?#28  0805-1KΩ-5%  [R0603]
R?#29  0805-6kΩ-5%  [R0603]
R?#30  0805-6kΩ-5%  [R0603]
R?#31  0805-10KΩ-5%  [R0603]
R?#32  0805-2KΩ-5%  [R0603]
R?#33  0805-20KΩ-5%  [R0603]
R?#34  0805-240Ω-5%  [R0603]
R?#35  0805-0.3Ω-5%  [R0603]
R?#36  0805-20KΩ-5%  [R0603]
R?#37  0805-200Ω-5%  [R0603]
R?#38  0805-2KΩ-5%  [R0603]
R?#39  0805-10KΩ-5%  [R0603]
R?#40  0805-3.3KΩ-5%  [R0603]
R?#41  0805-240Ω-5%  [R0603]
R?#42  0805-0.3Ω-5%  [R0603]
R?#43  0805-200Ω-5%  [R0603]
R?#44  3296w-1-202lf  [RES-ADJ-TH_3296W]  (value not drawn)
R?#45  0805-3.3kΩ-5%  [R0603]
R?#46  3296w-1-202lf  [RES-ADJ-TH_3296W]  (value not drawn)
R?#47  0805-10KΩ-5%  [R0603]
R?#48  0805-6kΩ-5%  [R0603]
R?#49  0805-2KΩ-5%  [R0603]
R?#50  0805-2.7KΩ-5%  [R0603]
R?#51  0805-6kΩ-5%  [R0603]
R?#52  0805-2.7kΩ-5%  [R0603]
R?#53  0805-6KΩ-5%  [R0603]
R?#54  0805-5kΩ-5%  [R0603]
R?#55  0805-6KΩ-5%  [R0603]
R?#56  0805-20kΩ-5%  [R0603]
R?#57  0805-1kΩ-5%  [R0603]
R?#58  0805-2KΩ-5%  [R0603]
R?#59  0805-2KΩ-5%  [R0603]
R?#60  0805-5KΩ-5%  [R0603]
R?#61  0805-1KΩ-5%  [R0603]
R?#62  0805-20KΩ-5%  [R0603]
R?#63  0805-500Ω-5%  [R0603]
R?#64  0805-1kΩ-5%  [R0603]
R?#65  0805-1kΩ-5%  [R0603]
R?#66  0805-6kΩ-5%  [R0603]
R?#67  0805-500Ω-5%  [R0603]
R?#68  0805-1KΩ-5%  [R0603]
R?#69  0805-1KΩ-5%  [R0603]
R?#70  0805-1KΩ-5%  [R0603]
R?#71  0805-75Ω-5%  [R0603]
R?#72  0805-10KΩ-5%  [R0603]
R?#73  0805-8KΩ-5%  [R0603]
R?#74  0805-20KΩ-5%  [R0603]
R?#75  0805-75Ω-5%  [R0603]
R?#76  0805-10KΩ-5%  [R0603]
R?#77  0805-8KΩ-5%  [R0603]
R?#78  0805-33Ω-5%  [R0603]
R?#79  0805-20KΩ-5%  [R0603]
R?#80  0805-2KΩ-5%  [R0603]
R?#81  0805-100Ω-5%  [R0603]
R?#82  0805-2KΩ-5%  [R0603]
R?#83  0805-4.7KΩ-5%  [R0603]
R?#84  0805-4.7KΩ-5%  [R0603]
R?#85  0805-4.7KΩ-5%  [R0603]
R?#86  0805-1KΩ-5%  [R0603]
R?#87  0805-4.5KΩ-5%  [R0603]
R?#88  0805-50Ω-5%  [R0603]
R?#89  0805-10Ω-5%  [R0603]
R?#90  0805-4.5KΩ-5%  [R0603]
R?#91  0805-2KΩ-5%  [R0603]
R?#92  0805-33Ω-5%  [R0603]
R?#93  0805-3KΩ-5%  [R0603]
R?#94  0805-2KΩ-5%  [R0603]
R?#95  0805-4.7KΩ-5%  [R0603]
R?#96  0805-3KΩ-5%  [R0603]
R?#97  0805-1.5KΩ-5%  [R0603]
R?#98  0805-4.7KΩ-5%  [R0603]
R?#99  0805-20K-5%  [R0603]
R?#100  0805-1.5KΩ-5%  [R0603]
R?#101  0805-2KΩ-5%  [R0603]
R?#102  0805-75KΩ-5%  [R0603]
R?#103  0805-820Ω-5%  [R0603]
R?#104  0805-20KΩ-5%  [R0603]
R?#105  0805-11KΩ-5%  [R0603]
R?#106  0805-8KΩ-5%  [R0603]
R?#107  0805-4.7KΩ-5%  [R0603]
R?#108  0805-4.7KΩ-5%  [R0603]
R?#109  0805-20KΩ-5%  [R0603]
R?#110  0805-20KΩ-5%  [R0603]
R?#111  0805-1KΩ-5%  [R0603]
R?#112  0805-20KΩ-5%  [R0603]
R?#113  0805-8KΩ-5%  [R0603]
R?#114  0805-75Ω-5%  [R0603]
R?#115  0805-6.8KΩ-5%  [R0603]
R?#116  0805-6.48KΩ-5%  [R0603]
R?#117  0805-1KΩ-5%  [R0603]
R?#118  0805-4.7KΩ-5%  [R0603]
R?#119  0805-560Ω-5%  [R0603]
R?#120  0805-2KΩ-5%  [R0603]
R?#121  0805-560Ω-5%  [R0603]
R?#122  3296w-1-202lf  [RES-ADJ-TH_3296W]  (value not drawn)
R?#123  0805-3.9KΩ-5%  [R0603]
R?#124  0805-1KΩ-5%  [R0603]
R?#125  0805-15KΩ-5%  [R0603]
R?#126  0805-4.7KΩ-5%  [R0603]
R?#127  0805-1KΩ-5%  [R0603]
R?#128  0805-4.5KΩ-5%  [R0603]
R?#129  0805-4.5KΩ-5%  [R0603]
R?#130  0805-220Ω-5%  [R0603]
R?#131  0805-4.7KΩ-5%  [R0603]
R?#132  0805-3KΩ-5%  [R0603]
R?#133  0805-3KΩ-5%  [R0603]
R?#134  0805-1.5KΩ-5%  [R0603]
R?#135  0805-100kΩ-5%  [R0603]
R?#136  0805-100Ω-5%  [R0603]
R?#137  0805-1.5KΩ-5%  [R0603]
R?#138  0805-10KΩ-5%  [R0603]
R?#139  0805-4.7KΩ-5%  [R0603]
R?#140  0805-4.7KΩ-5%  [R0603]
R?#141  0805-47Ω-5%  [R0603]
R?#142  0805-75Ω-5%  [R0603]
R?#143  0805-20KΩ-5%  [R0603]
R?#144  0805-10KΩ-5%  [R0603]
R?#145  0805-8KΩ-5%  [R0603]
R?#146  0805-75Ω-5%  [R0603]
R?#147  0805-100KΩ-5%  [R0603]
R?#148  0805-20KΩ-5%  [R0603]
R?#149  0805-10KΩ-5%  [R0603]
R?#150  0805-8KΩ-5%  [R0603]
R?#151  0805-2KΩ-5%  [R0603]
R?#152  0805-1KΩ-5%  [R0603]
R?#153  0805-100Ω-5%  [R0603]
R?#154  0805-4.7KΩ-5%  [R0603]
R?#155  0805-1KΩ-5%  [R0603]
R?#156  0805-4.5KΩ-5%  [R0603]
R?#157  0805-50Ω-5%  [R0603]
R?#158  0805-4.5KΩ-5%  [R0603]
R?#159  0805-2KΩ-5%  [R0603]
R?#160  0805-10Ω-5%  [R0603]
R?#161  0805-33Ω-5%  [R0603]
R?#162  0805-3KΩ-5%  [R0603]
R?#163  0805-2KΩ-5%  [R0603]
R?#164  0805-3KΩ-5%  [R0603]
R?#165  0805-100KΩ-5%  [R0603]
R?#166  0805-1.5KΩ-5%  [R0603]
R?#167  0805-1.5KΩ-5%  [R0603]
R?#168  0805-4.7KΩ-5%  [R0603]
R?#169  0805-20KΩ-5%  [R0603]
R?#170  0805-8KΩ-5%  [R0603]
R?#171  0805-75Ω-5%  [R0603]
R?#172  0805-20KΩ-5%  [R0603]
R?#173  0805-20KΩ-5%  [R0603]
R?#174  0805-8KΩ-5%  [R0603]
R?#175  0805-75KΩ-5%  [R0603]
R?#176  0603-1.2KΩ-5%  [R0603]
R?#177  0805-4.5KΩ-5%  [R0603]
R?#178  0805-4.5KΩ-5%  [R0603]
R?#179  0805-10KΩ-5%  [R0603]
R?#180  0805-3KΩ-5%  [R0603]
R?#181  0805-1.5KΩ-5%  [R0603]
R?#182  0805-3KΩ-5%  [R0603]
R?#183  0805-1.5KΩ-5%  [R0603]
R?#184  0805-2KΩ-5%  [R0603]
R?#185  0805-750Ω-5%  [R0603]
R?#186  0805-750Ω-5%  [R0603]
R?#187  0805-1KΩ-5%  [R0603]
R?#188  0805-820Ω-5%  [R0603]
R?#189  3296w-1-202lf  [RES-ADJ-TH_3296W]  (value not drawn)
R?#190  0805-680Ω-5%  [R0603]
R?#191  0805-5.6KΩ-5%  [R0603]
R?#192  0805-1KΩ-5%  [R0603]
R?#193  0805-10KΩ-5%  [R0603]
R?#194  0805-10KΩ-5%  [R0603]
R?#195  0805-10KΩ-5%  [R0603]
R?#196  0805-150Ω-5%  [R0603]
R?#197  0805-20KΩ-5%  [R0603]
R?#198  0805-20KΩ-5%  [R0603]
R?#199  0805-8KΩ-5%  [R0603]
R?#200  0805-75KΩ-5%  [R0603]
R?#201  0805-3.3KΩ-5%  [R0603]
R?#202  0805-10KΩ-5%  [R0603]
R?#203  0805-2KΩ-5%  [R0603]
R?#204  3296w-1-202lf  [RES-ADJ-TH_3296W]  (value not drawn)
R?#205  0805-4.7KΩ-5%  [R0603]
R?#206  0805-3.6KΩ-5%  [R0603]
R?#207  0603-3.9KΩ-5%  [R0603]
R?#208  0805-3.6KΩ-5%  [R0603]
R?#209  0805-2KΩ-5%  [R0603]
R?#210  0805-2.4KΩ-5%  [R0603]
R?#211  0805-2KΩ-5%  [R0603]
R?#212  0805-2KΩ-5%  [R0603]
R?#213  0805-4.5KΩ-5%  [R0603]
R?#214  0805-10KΩ-5%  [R0603]
R?#215  0805-2KΩ-5%  [R0603]
R?#216  0805-2KΩ-5%  [R0603]
R?#217  0805-2KΩ-5%  [R0603]
R?#218  0805-150Ω-5%  [R0603]
R?#219  3296w-1-202lf  [RES-ADJ-TH_3296W]  (value not drawn)
R?#220  0805-2KΩ-5%  [R0603]
R?#221  0805-2KΩ-5%  [R0603]
R?#222  0805-3KΩ-5%  [R0603]
R?#223  0805-4.2KΩ-5%  [R0603]
R?#224  0805-1KΩ-5%  [R0603]
R?#225  0805-1.5KΩ-5%  [R0603]
R?#226  0805-2KΩ-5%  [R0603]
R?#227  0805-2KΩ-5%  [R0603]
R?#228  0603-750Ω-5%  [R0603]
R?#229  0805-820Ω-5%  [R0603]
RTCT?  (no value)  [TEST-TH_BD2.54-P1.4_RED]
U?#1  bf256b  [TO-92-3_L4.6-W3.9-P1.27-L]
U?#2  bf256b  [TO-92-3_L4.6-W3.9-P1.27-L]
ZD?#1  BZD52C15  [SOD-123_L2.7-W1.6-LS3.7-RD]
ZD?#2  BZD52C15  [SOD-123_L2.7-W1.6-LS3.7-RD]
ZD?#3  BZD52C27  [SOD-123_L2.7-W1.6-LS3.7-RD]
ZD?#4  BZD52C26V  [SOD-123_L2.7-W1.6-LS3.7-RD]
ZD?#5  BZD52C15  [SOD-123_L2.7-W1.6-LS3.7-RD]
ZD?#6  1N4148WT  [SOD-523_L1.2-W0.8-LS1.6-FD]
ZD?#7  BZD52C26V  [SOD-123_L2.7-W1.6-LS3.7-RD]
ZD?#8  1N4148WT  [SOD-523_L1.2-W0.8-LS1.6-FD]
ZD?#9  BZD52C18  [SOD-123_L2.7-W1.6-LS3.7-RD]
ZD?#10  BZD52C15  [SOD-123_L2.7-W1.6-LS3.7-RD]
ZD?#11  BZD52C6.2V  [SOD-123_L2.7-W1.6-LS3.7-RD]
ZD?#12  BZD52C6.2V  [SOD-123_L2.7-W1.6-LS3.7-RD]
ZD?#13  1N4148WT  [SOD-523_L1.2-W0.8-LS1.6-FD]
ZD?#14  1N4148WT  [SOD-523_L1.2-W0.8-LS1.6-FD]
ZD?#15  1N4148WT  [SOD-523_L1.2-W0.8-LS1.6-FD]
ZD?#16  1N4148WT  [SOD-523_L1.2-W0.8-LS1.6-FD]
ZD?#17  1N4148WT  [SOD-523_L1.2-W0.8-LS1.6-FD]
ZD?#18  1N4148WT  [SOD-523_L1.2-W0.8-LS1.6-FD]
ZD?#19  1N4148WT  [SOD-523_L1.2-W0.8-LS1.6-FD]
ZD?#20  1N4148WT  [SOD-523_L1.2-W0.8-LS1.6-FD]
ZD?#21  1N4148WT  [SOD-523_L1.2-W0.8-LS1.6-FD]
ZD?#22  1N4148WT  [SOD-523_L1.2-W0.8-LS1.6-FD]
ZD?#23  1N4148WT  [SOD-523_L1.2-W0.8-LS1.6-FD]
ZD?#24  1N4148WT  [SOD-523_L1.2-W0.8-LS1.6-FD]
ZD?#25  1N4148WT  [SOD-523_L1.2-W0.8-LS1.6-FD]
ZD?#26  1N4148WT  [SOD-523_L1.2-W0.8-LS1.6-FD]
ZD?#27  1N4148WT  [SOD-523_L1.2-W0.8-LS1.6-FD]
ZD?#28  BZD52C6  [SOD-123_L2.7-W1.6-LS3.7-RD]
ZD?#29  1N4148WT  [SOD-523_L1.2-W0.8-LS1.6-FD]
ZD?#30  1N4148WT  [SOD-523_L1.2-W0.8-LS1.6-FD]
ZD?#31  1N4148WT  [SOD-523_L1.2-W0.8-LS1.6-FD]
ZD?#32  BZD52C10V  [SOD-123_L2.7-W1.6-LS3.7-RD]
ZD?#33  1N4148WT  [SOD-523_L1.2-W0.8-LS1.6-FD]
ZD?#34  1N4148WT  [SOD-523_L1.2-W0.8-LS1.6-FD]
ZD?#35  BZD52C3V3  [SOD-123_L2.7-W1.6-LS3.7-RD]
ZD?#36  1N4148WT  [SOD-523_L1.2-W0.8-LS1.6-FD]
ZD?#37  1N4148WT  [SOD-523_L1.2-W0.8-LS1.6-FD]
ZD?#38  1N4148WT  [SOD-523_L1.2-W0.8-LS1.6-FD]
ZD?#39  1N4148WT  [SOD-523_L1.2-W0.8-LS1.6-FD]
ZD?#40  1N4148WT  [SOD-523_L1.2-W0.8-LS1.6-FD]
ZD?#41  1N4148WT  [SOD-523_L1.2-W0.8-LS1.6-FD]
ZD?#42  1N4148WT  [SOD-523_L1.2-W0.8-LS1.6-FD]
ZD?#43  1N4148WT  [SOD-523_L1.2-W0.8-LS1.6-FD]
ZD?#44  1N4148WT  [SOD-523_L1.2-W0.8-LS1.6-FD]
ZD?#45  1N4148WT  [SOD-523_L1.2-W0.8-LS1.6-FD]
ZD?#46  1N4148WT  [SOD-523_L1.2-W0.8-LS1.6-FD]
ZD?#47  1N4148WT  [SOD-523_L1.2-W0.8-LS1.6-FD]
ZD?#48  1N4148WT  [SOD-523_L1.2-W0.8-LS1.6-FD]
ZD?#49  1N4148WT  [SOD-523_L1.2-W0.8-LS1.6-FD]
ZD?#50  1N4148WT  [SOD-523_L1.2-W0.8-LS1.6-FD]
ZD?#51  1N4148WT  [SOD-523_L1.2-W0.8-LS1.6-FD]
ZD?#52  1N4148WT  [SOD-523_L1.2-W0.8-LS1.6-FD]
ZD?#53  1N4148WT  [SOD-523_L1.2-W0.8-LS1.6-FD]
ZD?#54  1N4148WT  [SOD-523_L1.2-W0.8-LS1.6-FD]
ZD?#55  1N4148WT  [SOD-523_L1.2-W0.8-LS1.6-FD]
ZD?#56  1N4148WT  [SOD-523_L1.2-W0.8-LS1.6-FD]
ZD?#57  1N4148WT  [SOD-523_L1.2-W0.8-LS1.6-FD]
ZD?#58  1N4148WT  [SOD-523_L1.2-W0.8-LS1.6-FD]
ZD?#59  1N4148WT  [SOD-523_L1.2-W0.8-LS1.6-FD]
ZD?#60  BZD52C1V  [SOD-123_L2.7-W1.6-LS3.7-RD]
ZD?#61  1N4148WT  [SOD-523_L1.2-W0.8-LS1.6-FD]
ZD?#62  1N4148WT  [SOD-523_L1.2-W0.8-LS1.6-FD]
ZD?#63  1N4148WT  [SOD-523_L1.2-W0.8-LS1.6-FD]
ZD?#64  1N4148WT  [SOD-523_L1.2-W0.8-LS1.6-FD]
ZD?#65  1N4148WT  [SOD-523_L1.2-W0.8-LS1.6-FD]
ZD?#66  BZD52C3.3V  [SOD-123_L2.7-W1.6-LS3.7-RD]
ZD?#67  1N4148WT  [SOD-523_L1.2-W0.8-LS1.6-FD]
ZD?#68  1N4148WT  [SOD-523_L1.2-W0.8-LS1.6-FD]

## Blocks framed on the sheet
外部芯片引脚端口: H?#1-H?#4 H?#6-H?#10
7812: C?#12-C?#14 C?#19 N?#17-N?#19 N?#22 N?#27 N?#29 N?#31 N?#34 N?#39-N?#41 N?#43-N?#45 P?#11 P?#12 P?#16 R?#16 R?#17 R?#20-R?#22 R?#34 R?#35 R?#37 R?#40 R?#44 R?#48 R?#50 R?#51 R?#54 R?#56 R?#57 R?#63-R?#66 ZD?#4 ZD?#11
7805: C?#17 C?#18 C?#26 H?#12 N?#20 N?#21 N?#23 N?#25 N?#30 N?#33 N?#35 N?#38 N?#42 N?#46-N?#50 P?#13 P?#14 P?#17 R?#25 R?#26 R?#29-R?#31 R?#41-R?#43 R?#45 R?#46 R?#52 R?#53 R?#55 R?#60-R?#62 R?#67-R?#70 ZD?#7 ZD?#12
内部电源和外部电源选择: D?#6 D?#7 H?#13-H?#15 Q?#2 R?#47
与门: C?#27 H?#17 H?#23 N?#51 N?#54 N?#55 N?#60 N?#67 N?#70 R?#71-R?#74 R?#87 R?#93 R?#97 ZD?#13 ZD?#14 ZD?#18 ZD?#20 ZD?#21 ZD?#25-ZD?#27
与门: C?#28 N?#52 N?#56 N?#57 N?#62 N?#63 N?#68 N?#71 R?#75-R?#77 R?#79 R?#90 R?#96 R?#100 ZD?#16 ZD?#17 ZD?#19 ZD?#22 ZD?#24 ZD?#29-ZD?#31
上桥驱动: C?#29 C?#34 H?#19 N?#58 N?#64-N?#66 N?#72 N?#73 P?#18-P?#20 R?#78 R?#80 R?#82-R?#85 R?#89 R?#91 R?#92 R?#94 R?#95 R?#98 R?#99 R?#101 ZD?#15 ZD?#23 ZD?#28 ZD?#32
三输入或门: C?#31 D?#10-D?#12 D?#14 D?#17 D?#18 D?#21 D?#23-D?#26 H?#31 N?#75 N?#81 N?#82 N?#89 N?#97 N?#98 N?#103 N?#107 N?#110-N?#112 N?#116 R?#102 R?#104-R?#106 R?#109 R?#110 R?#128 R?#133 R?#137
非门: C?#32 D?#13 D?#16 D?#19 D?#20 D?#22 H?#32 N?#80 N?#85 N?#90 N?#91 N?#94 N?#106 N?#114 R?#112-R?#114 R?#129 R?#132 R?#134
信号级施密特触发器（5V欠压保护）: C?#35 D?#15 H?#26 H?#27 N?#69 N?#78 N?#86-N?#88 N?#101 N?#102 N?#113 R?#119-R?#121 R?#152 ZD?#34 ZD?#35
阈值比较器: C?#42 N?#92 N?#95 N?#100 N?#104 N?#109 P?#23-P?#26 R?#103 R?#107 R?#108 R?#138
触发比较器: N?#93 P?#27 P?#29-P?#32 R?#111 R?#147
触发器: N?#76 N?#96 N?#105 N?#108 N?#117 P?#21 P?#22 R?#125 R?#126
输出: H?#29 N?#74 N?#77 N?#79 N?#83 N?#99 N?#115 N?#118 N?#119 P?#28 P?#33 R?#115 R?#123 R?#130 R?#135 R?#136 R?#140
PWM取反输出: C?#36 C?#37 H?#36 N?#84 R?#117 R?#124 R?#127
与门: C?#39 H?#40 N?#120 N?#123 N?#124 N?#129 N?#134 N?#138 R?#142-R?#145 R?#156 R?#162 R?#166 ZD?#38 ZD?#39 ZD?#42 ZD?#44 ZD?#45 ZD?#49-ZD?#51
与门: C?#40 N?#121 N?#125 N?#126 N?#131 N?#137 N?#139 R?#146 R?#148-R?#150 R?#158 R?#164 R?#167 ZD?#40 ZD?#41 ZD?#43 ZD?#46 ZD?#47 ZD?#52-ZD?#54
下桥驱动: C?#44 H?#35 N?#127 N?#133 N?#135 N?#136 P?#34 P?#35 R?#151 R?#154 R?#159-R?#161 R?#163 R?#165 R?#168 ZD?#48
RS触发器（或非门搭建）: C?#47 C?#51 D?#29 D?#30 D?#33 D?#35 D?#36 D?#38 D?#39 D?#42 D?#43 D?#46-D?#48 D?#50 D?#51 H?#43 H?#46 H?#47 H?#53 H?#55 H?#56 N?#142 N?#145-N?#148 N?#150 N?#151 N?#153 N?#154 N?#166 N?#169 N?#170 N?#174 N?#177 N?#178 N?#186 N?#196 R?#172-R?#175 R?#178 R?#182 R?#183 R?#197-R?#200 R?#213 R?#222 R?#225
非门: C?#46 D?#28 D?#31 D?#32 D?#34 D?#37 H?#45 N?#140 N?#141 N?#143 N?#144 N?#149 N?#152 R?#169-R?#171 R?#177 R?#180 R?#181
恒流源: COMP?#1 P?#36 R?#176 R?#179 ZD?#55-ZD?#57
反馈基准电压（TL431）: C?#50 C?#57 COMP?#2 COMP?#3 N?#157-N?#160 N?#163 N?#164 N?#175 N?#179-N?#181 N?#195 Q?#7 Q?#8 R?#185 R?#186 R?#196 R?#201 R?#202 R?#206-R?#208 R?#210 R?#224 R?#228 ZD?#61 ZD?#63
1V: R?#184 R?#187 ZD?#58-ZD?#60
外置环路补偿: C?#49 R?#189